# Altium project FPGA_Modular_DevBoard.PrjPcb (part 1 of 2)
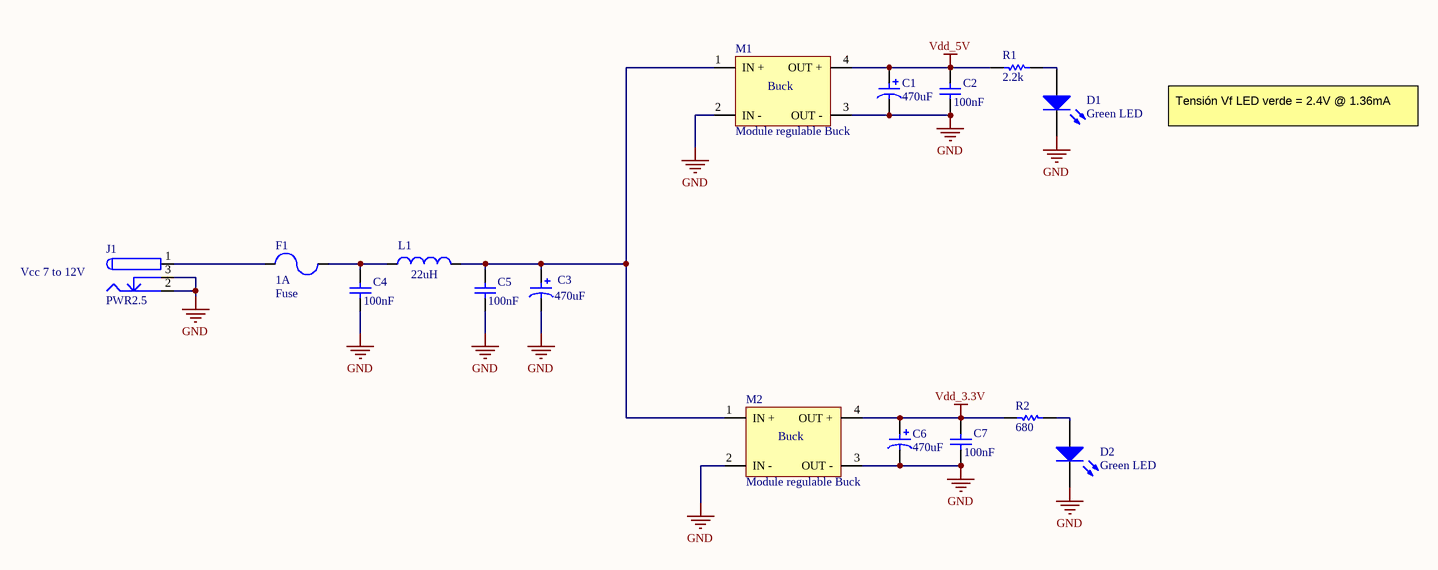
[diagram p0: power_supply.SchDoc]
15 sheets, 292 parts. Net scope: global (net labels, ports and power ports of the same name join across sheets).
Board file: PCB.PcbDoc
Sheets:
  power_supply.SchDoc
  FPGA_J3_J4.SchDoc
  FPGA_J6_J8.SchDoc
  FPGA_breadboard_connections.SchDoc
  stm32h750.SchDoc
  stm32f411.SchDoc
  SRAM.SchDoc
  Parallel_NOR_FLASH.SchDoc
  NOR_flash.SchDoc
  USB_TTL_converter.SchDoc
  buzzer.SchDoc
  micro_sd.SchDoc
  LEDs.SchDoc
  buttons_switches.SchDoc
  seven_segment_displays.SchDoc

## Sheet power_supply.SchDoc
size A3; SheetNumber: 1; SheetTotal: 16; SPICEModelCacheCEUNFSJS: <root> / <DocumentId>CEUNFSJS</DocumentId> / </root>

### Parts
C1  value 470uF  [electrolytic 470uF/25V]  (hidden comment: Electrolytic capacitor)
C2  value 100nF  [capacitor 0805]  (hidden comment: ceramic capacitor)
C3  value 470uF  [electrolytic 470uF/25V]  (hidden comment: Electrolytic capacitor)
C4  value 100nF  [capacitor 0805]  (hidden comment: ceramic capacitor)
C5  value 100nF  [capacitor 0805]  (hidden comment: ceramic capacitor)
C6  value 470uF  [electrolytic 470uF/25V]  (hidden comment: Electrolytic capacitor)
C7  value 100nF  [capacitor 0805]  (hidden comment: ceramic capacitor)
D1  Green LED  [led 0603 clear]
D2  Green LED  [led 0603 clear]
F1  Fuse  value 1A  [Fuse]
J1  PWR2.5  [female connector DC-005]
L1  value 22uH  [ferrite inductor 22uH]  (hidden comment: Inductor)
M1  Module regulable Buck  [module step down MP1584]
M2  Module regulable Buck  [module step down MP1584]
R1  value 2.2k  [resistor 0603]  (hidden comment: resistor)
R2  value 680  [resistor 0603]  (hidden comment: resistor)

### Nets
GND: C1.2 C2.2 C3.2 C4.2 C5.2 C6.2 C7.2 D1.2(K) D2.2(K) J1.2 J1.3 M1.2(IN_-) M1.3(OUT_-) M2.2(IN_-) M2.3(OUT_-)
Vdd_3.3V: C6.1 C7.1 M2.4(OUT_+) R2.2
Vdd_5V: C1.1 C2.1 M1.4(OUT_+) R1.2
NetC3_1: C3.1 C5.1 L1.2 M1.1(IN_+) M2.1(IN_+)
NetC4_1: C4.1 F1.2 L1.1
NetD1_1: D1.1(A) R1.1
NetD2_1: D2.1(A) R2.1
NetF1_1: F1.1 J1.1

### Notes on the sheet
- Tensión Vf LED verde = 2.4V @ 1.36mA
- Vcc 7 to 12V
- (in symbol Module regulable Step Down converter) Buck

### Library data of the parts
C2 C4 C5 C7 = ceramic capacitor: Multilayer ceramic capacitor; V: 50; LCSC part: C1711; Package: 0805
D1 D2 = LED2: Green LED 0603; Package: 0603
J1 = PWR2.5: Low Voltage Power Supply Connector; Publisher: Altium Limited
M1 M2 = Module regulable Step Down converter: pin to pad: 1>2 2>1 3>4 4>3
R1 R2 = resistor: Package: 0603

## Sheet FPGA_J3_J4.SchDoc
size A3; SheetNumber: 2; SheetTotal: 14
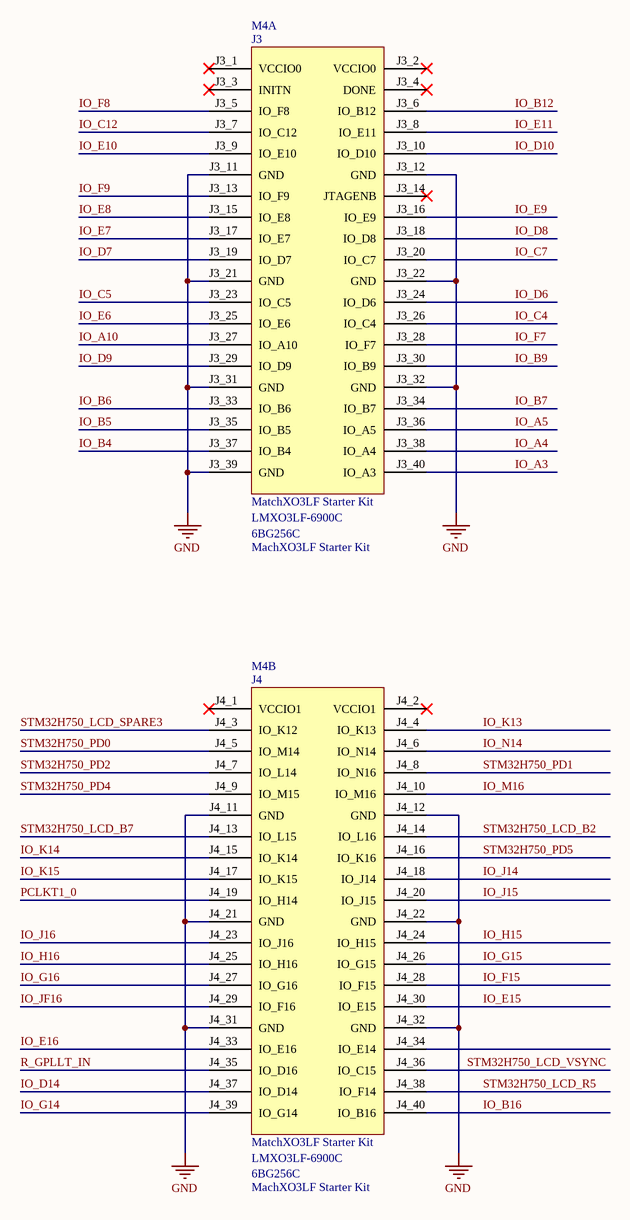
[diagram p1: FPGA_J3_J4.SchDoc]

### Parts
M4  MachXO3LF Starter Kit  [Lattice MachXO3LF starter kit]  (parts A,B of 4)

### Nets
GND: M4.J3_11(GND) M4.J3_12(GND) M4.J3_21(GND) M4.J3_22(GND) M4.J3_31(GND) M4.J3_32(GND) M4.J3_39(GND) M4.J4_11(GND) M4.J4_12(GND) M4.J4_21(GND) M4.J4_22(GND) M4.J4_31(GND) M4.J4_32(GND)
IO_A3: M4.J3_40(IO_A3)
IO_A4: M4.J3_38(IO_A4)
IO_A5: M4.J3_36(IO_A5)
IO_A10: M4.J3_27(IO_A10)
IO_B4: M4.J3_37(IO_B4)
IO_B5: M4.J3_35(IO_B5)
IO_B6: M4.J3_33(IO_B6)
IO_B7: M4.J3_34(IO_B7)
IO_B9: M4.J3_30(IO_B9)
IO_B12: M4.J3_6(IO_B12)
IO_B16: M4.J4_40(IO_B16)
IO_C4: M4.J3_26(IO_C4)
IO_C5: M4.J3_23(IO_C5)
IO_C7: M4.J3_20(IO_C7)
IO_C12: M4.J3_7(IO_C12)
IO_D6: M4.J3_24(IO_D6)
IO_D7: M4.J3_19(IO_D7)
IO_D8: M4.J3_18(IO_D8)
IO_D9: M4.J3_29(IO_D9)
IO_D10: M4.J3_10(IO_D10)
IO_D14: M4.J4_37(IO_D14)
IO_E6: M4.J3_25(IO_E6)
IO_E7: M4.J3_17(IO_E7)
IO_E8: M4.J3_15(IO_E8)
IO_E9: M4.J3_16(IO_E9)
IO_E10: M4.J3_9(IO_E10)
IO_E11: M4.J3_8(IO_E11)
IO_E15: M4.J4_30(IO_E15)
IO_E16: M4.J4_33(IO_E16)
IO_F7: M4.J3_28(IO_F7)
IO_F8: M4.J3_5(IO_F8)
IO_F9: M4.J3_13(IO_F9)
IO_F15: M4.J4_28(IO_F15)
IO_G14: M4.J4_39(IO_G14)
IO_G15: M4.J4_26(IO_G15)
IO_G16: M4.J4_27(IO_G16)
IO_H15: M4.J4_24(IO_H15)
IO_H16: M4.J4_25(IO_H16)
IO_J14: M4.J4_18(IO_J14)
IO_J15: M4.J4_20(IO_J15)
IO_J16: M4.J4_23(IO_J16)
IO_JF16: M4.J4_29(IO_F16)
IO_K13: M4.J4_4(IO_K13)
IO_K14: M4.J4_15(IO_K14)
IO_K15: M4.J4_17(IO_K15)
IO_M16: M4.J4_10(IO_M16)
IO_N14: M4.J4_6(IO_N14)
PCLKT1_0: M4.J4_19(IO_H14)
R_GPLLT_IN: M4.J4_35(IO_D16)
STM32H750_LCD_B2: M4.J4_14(IO_L16)
STM32H750_LCD_B7: M4.J4_13(IO_L15)
STM32H750_LCD_R5: M4.J4_38(IO_F14)
STM32H750_LCD_SPARE3: M4.J4_3(IO_K12)
STM32H750_LCD_VSYNC: M4.J4_36(IO_C15)
STM32H750_PD0: M4.J4_5(IO_M14)
STM32H750_PD1: M4.J4_8(IO_N16)
STM32H750_PD2: M4.J4_7(IO_L14)
STM32H750_PD4: M4.J4_9(IO_M15)
STM32H750_PD5: M4.J4_16(IO_K16)

Not connected (* = marked no-connect by the designer): M4 J3_1(VCCIO0)* J3_2(VCCIO0)* J3_3(INITN)* J3_4(DONE)* J3_14(JTAGENB)* J4_1(VCCIO1)* J4_2(VCCIO1)* J4_34(IO_E14)

### Notes on the sheet
- (in symbol Lattice_MachXO3LF_starter_kit, part A) J3; MatchXO3LF Starter Kit; LMXO3LF-6900C; 6BG256C
- (in symbol Lattice_MachXO3LF_starter_kit, part B) J4; MatchXO3LF Starter Kit; LMXO3LF-6900C; 6BG256C

### Library data of the parts
M4 = Lattice_MachXO3LF_starter_kit: FPGA development board - MachXO3LF Starter Kit

## Sheet FPGA_J6_J8.SchDoc
size A3; SheetNumber: 3; SheetTotal: 14
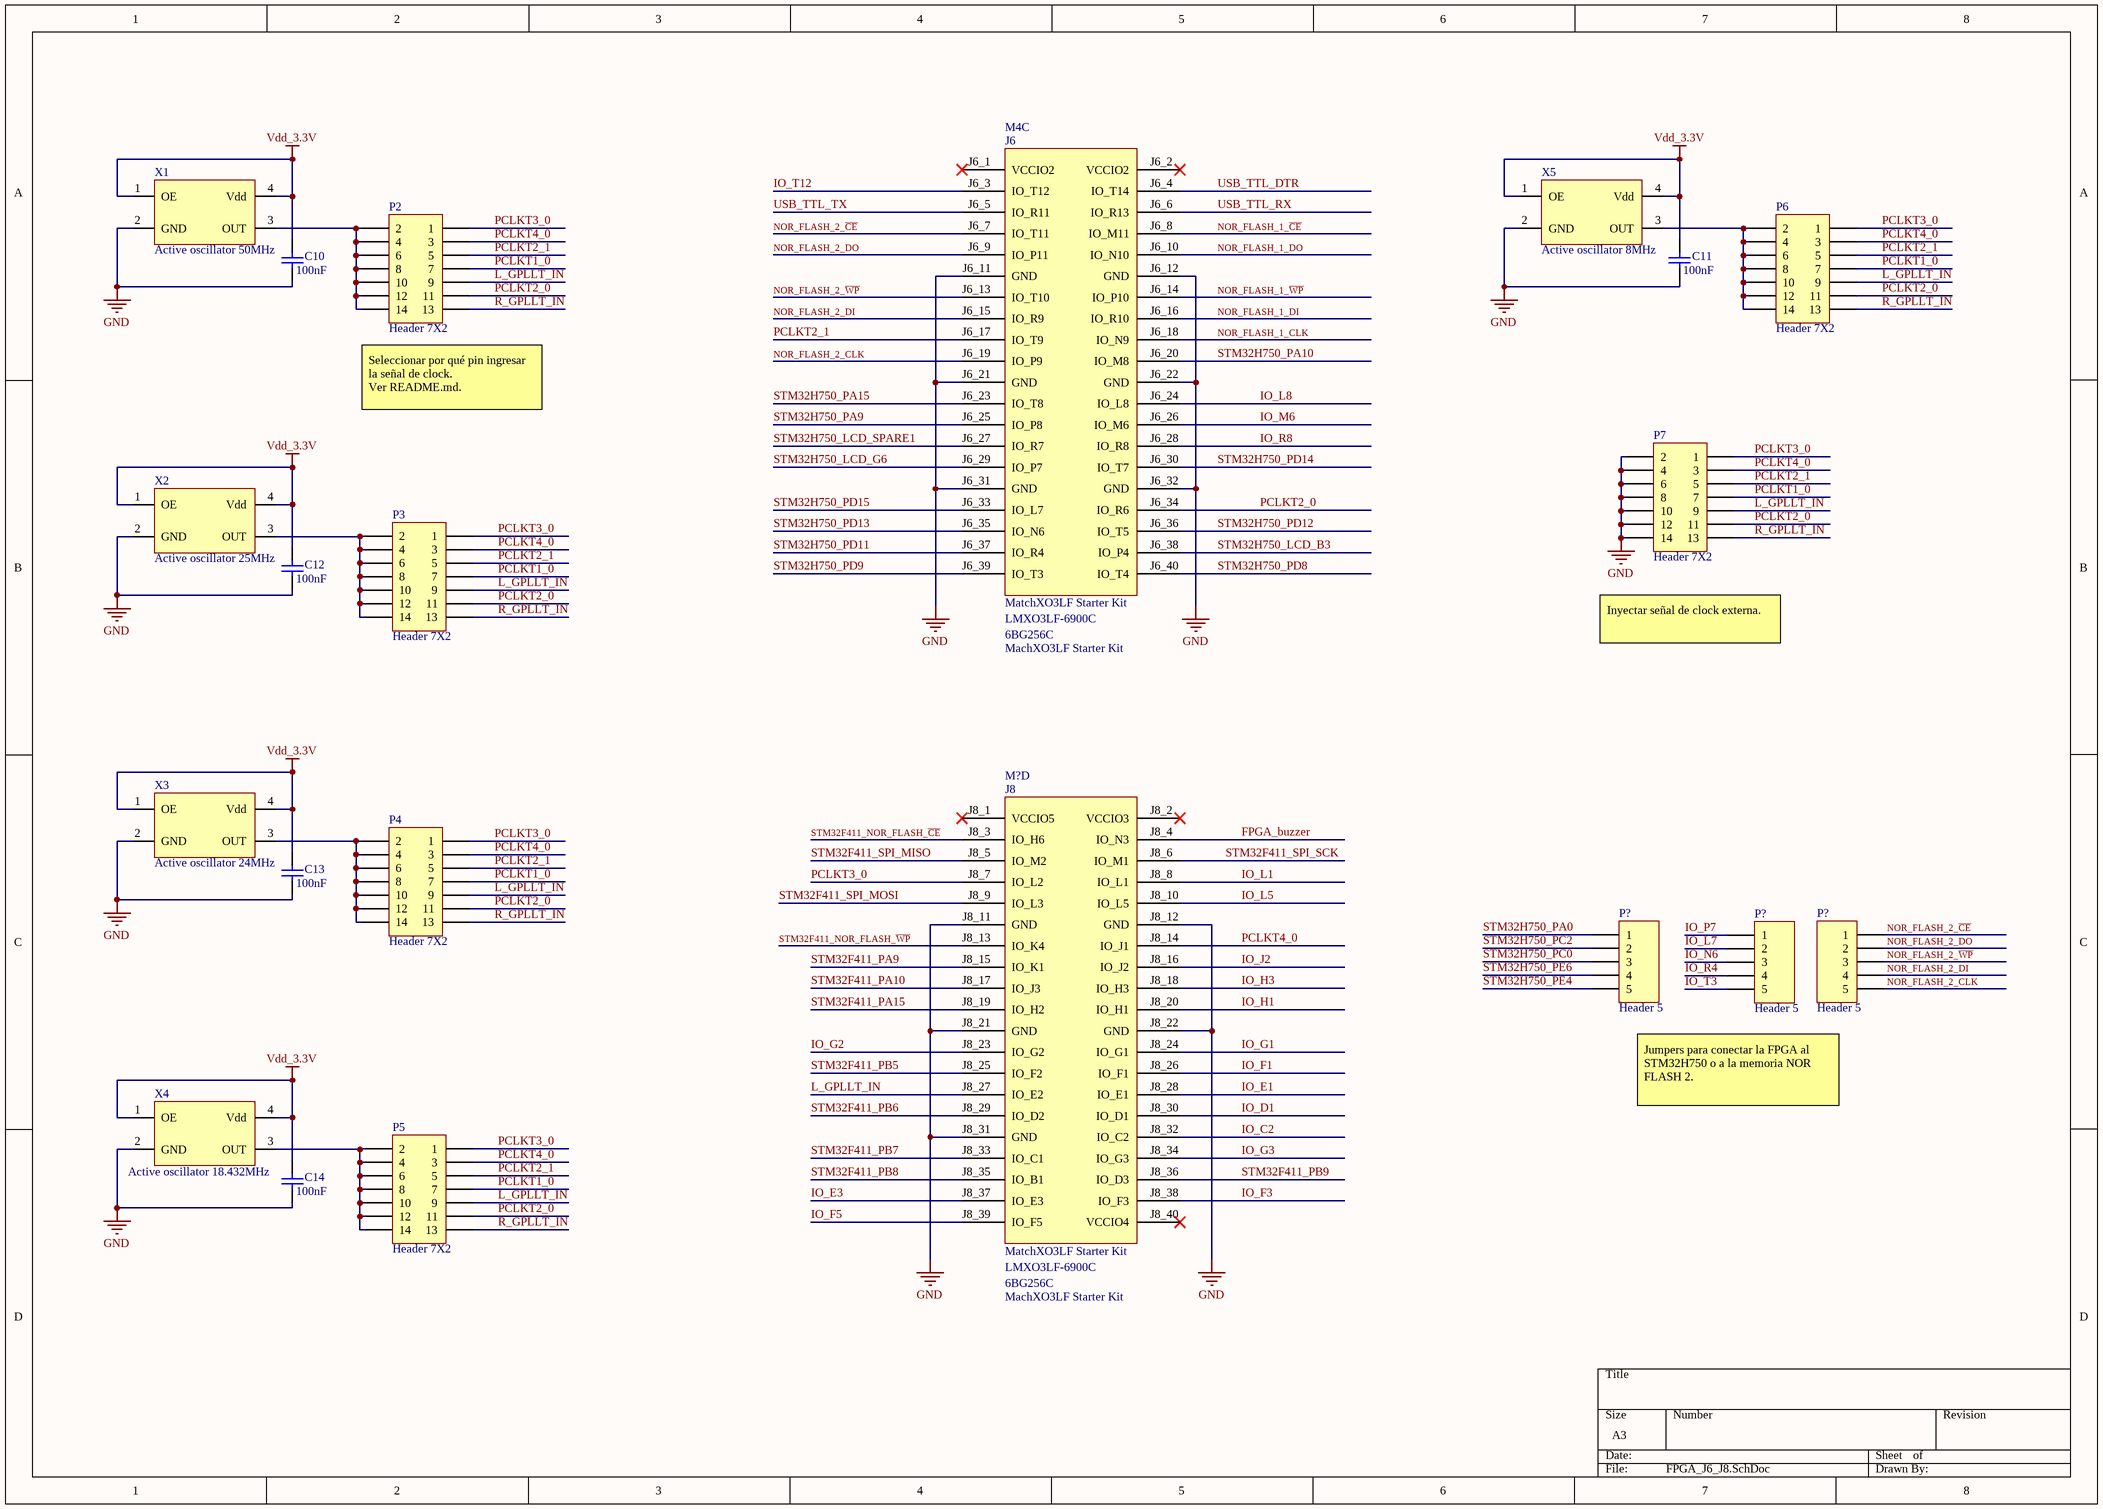
[diagram p2: FPGA_J6_J8.SchDoc]

### Parts
(Parts that share a designator on the sheet are numbered #1, #2 ... from top to bottom, then left to right.)
C10  value 100nF  [capacitor 0603]  (hidden comment: Ceramic capacitor)
C11  value 100nF  [capacitor 0603]  (hidden comment: Ceramic capacitor)
C12  value 100nF  [capacitor 0603]  (hidden comment: Ceramic capacitor)
C13  value 100nF  [capacitor 0603]  (hidden comment: Ceramic capacitor)
C14  value 100nF  [capacitor 0603]  (hidden comment: Ceramic capacitor)
M4  MachXO3LF Starter Kit  [Lattice MachXO3LF starter kit]  (part C of 4)
M?  MachXO3LF Starter Kit  [Lattice MachXO3LF starter kit]  (part D of 4)
P2  Header 7X2  [HDR2X7]
P3  Header 7X2  [HDR2X7]
P4  Header 7X2  [HDR2X7]
P5  Header 7X2  [HDR2X7]
P6  Header 7X2  [HDR2X7]
P7  Header 7X2  [HDR2X7]
P?#1  Header 5  [HDR1X5]
P?#2  Header 5  [HDR1X5]
P?#3  Header 5  [HDR1X5]
X1  Active oscillator 50MHz  [Active oscillator 3.2mm x 2.5mm]
X2  Active oscillator 25MHz  [Active oscillator 3.2mm x 2.5mm]
X3  Active oscillator 24MHz  [Active oscillator 3.2mm x 2.5mm]
X4  Active oscillator 18.432MHz  [Active oscillator 3.2mm x 2.5mm]
X5  Active oscillator 8MHz  [Active oscillator 3.2mm x 2.5mm]

### Nets
GND: C10.1 C11.1 C12.1 C13.1 C14.1 M4.J6_11(GND) M4.J6_12(GND) M4.J6_21(GND) M4.J6_22(GND) M4.J6_31(GND) M4.J6_32(GND) M?.J8_11(GND) M?.J8_12(GND) M?.J8_21(GND) M?.J8_22(GND) M?.J8_31(GND) P7.2 P7.4 P7.6 P7.8 P7.10 P7.12 P7.14 X1.2(GND) X2.2(GND) X3.2(GND) X4.2(GND) X5.2(GND)
Vdd_3.3V: C10.2 C11.2 C12.2 C13.2 C14.2 X1.1(OE) X1.4(Vdd) X2.1(OE) X2.4(Vdd) X3.1(OE) X3.4(Vdd) X4.1(OE) X4.4(Vdd) X5.1(OE) X5.4(Vdd)
FPGA_buzzer: M?.J8_4(IO_N3)
IO_C2: M?.J8_32(IO_C2)
IO_D1: M?.J8_30(IO_D1)
IO_E1: M?.J8_28(IO_E1)
IO_E3: M?.J8_37(IO_E3)
IO_F1: M?.J8_26(IO_F1)
IO_F3: M?.J8_38(IO_F3)
IO_F5: M?.J8_39(IO_F5)
IO_G1: M?.J8_24(IO_G1)
IO_G2: M?.J8_23(IO_G2)
IO_G3: M?.J8_34(IO_G3)
IO_H1: M?.J8_20(IO_H1)
IO_H3: M?.J8_18(IO_H3)
IO_J2: M?.J8_16(IO_J2)
IO_L1: M?.J8_8(IO_L1)
IO_L5: M?.J8_10(IO_L5)
IO_L7: P?#2.2
IO_L8: M4.J6_24(IO_L8)
IO_M6: M4.J6_26(IO_M6)
IO_N6: P?#2.3
IO_P7: P?#2.1
IO_R4: P?#2.4
IO_R8: M4.J6_28(IO_R8)
IO_T3: P?#2.5
IO_T12: M4.J6_3(IO_T12)
L_GPLLT_IN: M?.J8_27(IO_E2) P2.9 P3.9 P4.9 P5.9 P6.9 P7.9
NOR_FLASH_1_~{CE}: M4.J6_8(IO_M11)
NOR_FLASH_1_CLK: M4.J6_18(IO_N9)
NOR_FLASH_1_DI: M4.J6_16(IO_R10)
NOR_FLASH_1_DO: M4.J6_10(IO_N10)
NOR_FLASH_1_~{WP}: M4.J6_14(IO_P10)
NOR_FLASH_2_~{CE}: M4.J6_7(IO_T11) P?#3.1
NOR_FLASH_2_CLK: M4.J6_19(IO_P9) P?#3.5
NOR_FLASH_2_DI: M4.J6_15(IO_R9) P?#3.4
NOR_FLASH_2_DO: M4.J6_9(IO_P11) P?#3.2
NOR_FLASH_2_~{WP}: M4.J6_13(IO_T10) P?#3.3
PCLKT1_0: P2.7 P3.7 P4.7 P5.7 P6.7 P7.7
PCLKT2_0: M4.J6_34(IO_R6) P2.11 P3.11 P4.11 P5.11 P6.11 P7.11
PCLKT2_1: M4.J6_17(IO_T9) P2.5 P3.5 P4.5 P5.5 P6.5 P7.5
PCLKT3_0: M?.J8_7(IO_L2) P2.1 P3.1 P4.1 P5.1 P6.1 P7.1
PCLKT4_0: M?.J8_14(IO_J1) P2.3 P3.3 P4.3 P5.3 P6.3 P7.3
R_GPLLT_IN: P2.13 P3.13 P4.13 P5.13 P6.13 P7.13
STM32F411_NOR_FLASH_~{CE}: M?.J8_3(IO_H6)
STM32F411_NOR_FLASH_~{WP}: M?.J8_13(IO_K4)
STM32F411_PA9: M?.J8_15(IO_K1)
STM32F411_PA10: M?.J8_17(IO_J3)
STM32F411_PA15: M?.J8_19(IO_H2)
STM32F411_PB5: M?.J8_25(IO_F2)
STM32F411_PB6: M?.J8_29(IO_D2)
STM32F411_PB7: M?.J8_33(IO_C1)
STM32F411_PB8: M?.J8_35(IO_B1)
STM32F411_PB9: M?.J8_36(IO_D3)
STM32F411_SPI_MISO: M?.J8_5(IO_M2)
STM32F411_SPI_MOSI: M?.J8_9(IO_L3)
STM32F411_SPI_SCK: M?.J8_6(IO_M1)
STM32H750_LCD_B3: M4.J6_38(IO_P4)
STM32H750_LCD_G6: M4.J6_29(IO_P7)
STM32H750_LCD_SPARE1: M4.J6_27(IO_R7)
STM32H750_PA0: P?#1.1
STM32H750_PA9: M4.J6_25(IO_P8)
STM32H750_PA10: M4.J6_20(IO_M8)
STM32H750_PA15: M4.J6_23(IO_T8)
STM32H750_PC0: P?#1.3
STM32H750_PC2: P?#1.2
STM32H750_PD8: M4.J6_40(IO_T4)
STM32H750_PD9: M4.J6_39(IO_T3)
STM32H750_PD11: M4.J6_37(IO_R4)
STM32H750_PD12: M4.J6_36(IO_T5)
STM32H750_PD13: M4.J6_35(IO_N6)
STM32H750_PD14: M4.J6_30(IO_T7)
STM32H750_PD15: M4.J6_33(IO_L7)
STM32H750_PE4: P?#1.5
STM32H750_PE6: P?#1.4
USB_TTL_DTR: M4.J6_4(IO_T14)
USB_TTL_RX: M4.J6_6(IO_R13)
USB_TTL_TX: M4.J6_5(IO_R11)
NetP2_2: P2.2 P2.4 P2.6 P2.8 P2.10 P2.12 P2.14 X1.3(OUT)
NetP3_2: P3.2 P3.4 P3.6 P3.8 P3.10 P3.12 P3.14 X2.3(OUT)
NetP4_2: P4.2 P4.4 P4.6 P4.8 P4.10 P4.12 P4.14 X3.3(OUT)
NetP5_2: P5.2 P5.4 P5.6 P5.8 P5.10 P5.12 P5.14 X4.3(OUT)
NetP6_2: P6.2 P6.4 P6.6 P6.8 P6.10 P6.12 P6.14 X5.3(OUT)

Not connected (* = marked no-connect by the designer): M4 J6_1(VCCIO2)* J6_2(VCCIO2)*; M? J8_1(VCCIO5)* J8_2(VCCIO3)* J8_40(VCCIO4)*

### Notes on the sheet
- (near P2) Seleccionar por qué pin ingresar la señal de clock.
  Ver README.md.
- Inyectar señal de clock externa.
- (near P?#2) Jumpers para conectar la FPGA al STM32H750 o a la memoria NOR FLASH 2.
- (in symbol Lattice_MachXO3LF_starter_kit, part C) J6; MatchXO3LF Starter Kit; LMXO3LF-6900C; 6BG256C
- (in symbol Lattice_MachXO3LF_starter_kit, part D) J8; MatchXO3LF Starter Kit; LMXO3LF-6900C; 6BG256C

### Library data of the parts
C10-C14 = Ceramic capacitor: Multilayer ceramic capacitor; V: 50; LCSC part: C14663; Package: 0603
M4 M? = Lattice_MachXO3LF_starter_kit: as M4 on sheet FPGA_J3_J4
P2-P7 = Header 7X2: Header, 7-Pin, Dual row; LatestRevisionDate: 17-Jul-2002; LatestRevisionNote: Re-released for DXP Platform.; Publisher: Altium Limited
P?#1-P?#3 = Header 5: Header, 5-Pin; LatestRevisionDate: 17-Jul-2002; LatestRevisionNote: Re-released for DXP Platform.; Publisher: Altium Limited
X1-X5 = Active oscillator

## Sheet FPGA_breadboard_connections.SchDoc
size A3; SheetNumber: 4; SheetTotal: 15
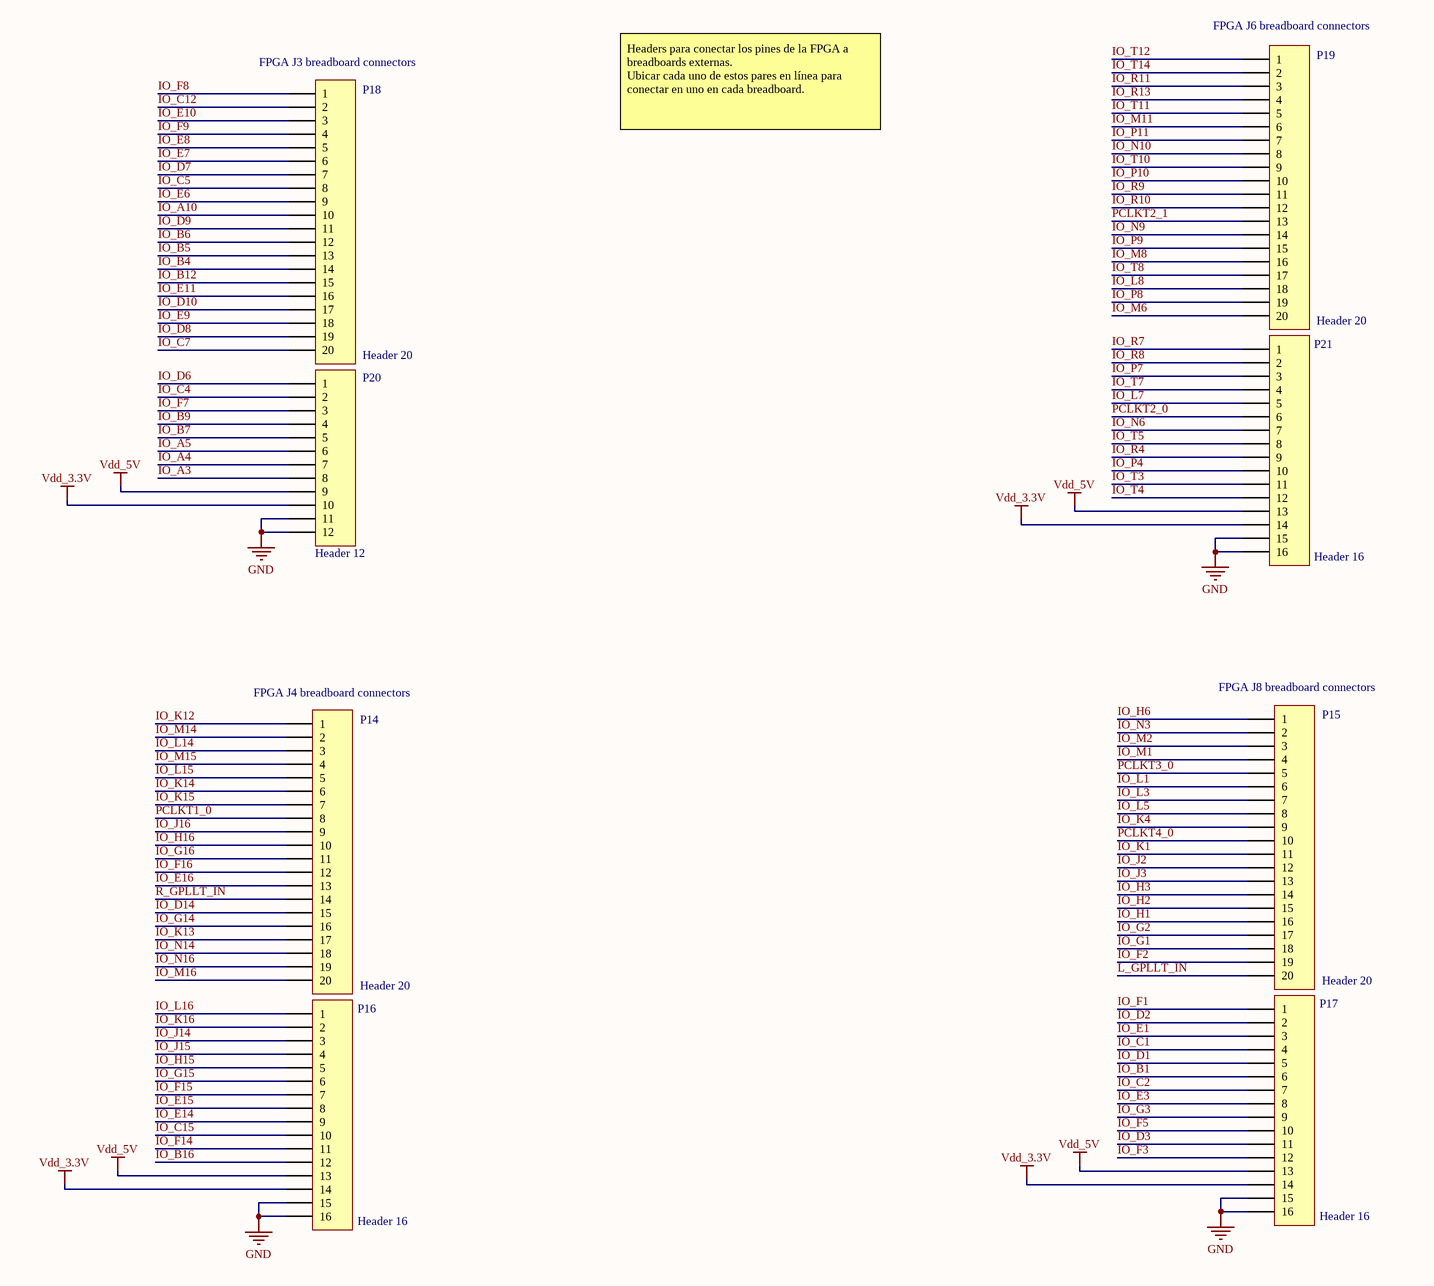
[diagram p3: FPGA_breadboard_connections.SchDoc]

### Parts
P14  Header 20  [HDR1X20]
P15  Header 20  [HDR1X20]
P16  Header 16  [HDR1X16]
P17  Header 16  [HDR1X16]
P18  Header 20  [HDR1X20]
P19  Header 20  [HDR1X20]
P20  Header 12  [HDR1X12]
P21  Header 16  [HDR1X16]

### Nets
GND: P16.15 P16.16 P17.15 P17.16 P20.11 P20.12 P21.15 P21.16
Vdd_3.3V: P16.14 P17.14 P20.10 P21.14
Vdd_5V: P16.13 P17.13 P20.9 P21.13
IO_A3: P20.8
IO_A4: P20.7
IO_A5: P20.6
IO_A10: P18.10
IO_B1: P17.6
IO_B4: P18.14
IO_B5: P18.13
IO_B6: P18.12
IO_B7: P20.5
IO_B9: P20.4
IO_B12: P18.15
IO_B16: P16.12
IO_C1: P17.4
IO_C2: P17.7
IO_C4: P20.2
IO_C5: P18.8
IO_C7: P18.20
IO_C12: P18.2
IO_C15: P16.10
IO_D1: P17.5
IO_D2: P17.2
IO_D3: P17.11
IO_D6: P20.1
IO_D7: P18.7
IO_D8: P18.19
IO_D9: P18.11
IO_D10: P18.17
IO_D14: P14.15
IO_E1: P17.3
IO_E3: P17.8
IO_E6: P18.9
IO_E7: P18.6
IO_E8: P18.5
IO_E9: P18.18
IO_E10: P18.3
IO_E11: P18.16
IO_E14: P16.9
IO_E15: P16.8
IO_E16: P14.13
IO_F1: P17.1
IO_F2: P15.19
IO_F3: P17.12
IO_F5: P17.10
IO_F7: P20.3
IO_F8: P18.1
IO_F9: P18.4
IO_F14: P16.11
IO_F15: P16.7
IO_F16: P14.12
IO_G1: P15.18
IO_G2: P15.17
IO_G3: P17.9
IO_G14: P14.16
IO_G15: P16.6
IO_G16: P14.11
IO_H1: P15.16
IO_H2: P15.15
IO_H3: P15.14
IO_H6: P15.1
IO_H15: P16.5
IO_H16: P14.10
IO_J2: P15.12
IO_J3: P15.13
IO_J14: P16.3
IO_J15: P16.4
IO_J16: P14.9
IO_K1: P15.11
IO_K4: P15.9
IO_K12: P14.1
IO_K13: P14.17
IO_K14: P14.6
IO_K15: P14.7
IO_K16: P16.2
IO_L1: P15.6
IO_L3: P15.7
IO_L5: P15.8
IO_L7: P21.5
IO_L8: P19.18
IO_L14: P14.3
IO_L15: P14.5
IO_L16: P16.1
IO_M1: P15.4
IO_M2: P15.3
IO_M6: P19.20
IO_M8: P19.16
IO_M11: P19.6
IO_M14: P14.2
IO_M15: P14.4
IO_M16: P14.20
IO_N3: P15.2
IO_N6: P21.7
IO_N9: P19.14
IO_N10: P19.8
IO_N14: P14.18
IO_N16: P14.19
IO_P4: P21.10
IO_P7: P21.3
IO_P8: P19.19
IO_P9: P19.15
IO_P10: P19.10
IO_P11: P19.7
IO_R4: P21.9
IO_R7: P21.1
IO_R8: P21.2
IO_R9: P19.11
IO_R10: P19.12
IO_R11: P19.3
IO_R13: P19.4
IO_T3: P21.11
IO_T4: P21.12
IO_T5: P21.8
IO_T7: P21.4
IO_T8: P19.17
IO_T10: P19.9
IO_T11: P19.5
IO_T12: P19.1
IO_T14: P19.2
L_GPLLT_IN: P15.20
PCLKT1_0: P14.8
PCLKT2_0: P21.6
PCLKT2_1: P19.13
PCLKT3_0: P15.5
PCLKT4_0: P15.10
R_GPLLT_IN: P14.14

### Notes on the sheet
- (near P19) FPGA J6 breadboard connectors
- (near P18) FPGA J3 breadboard connectors
- Headers para conectar los pines de la FPGA a breadboards externas.
  Ubicar cada uno de estos pares en línea para conectar en uno en cada breadboard.
- (near P14) FPGA J4 breadboard connectors
- (near P15) FPGA J8 breadboard connectors

### Library data of the parts
P14 P15 P18 P19 = Header 20: Header, 20-Pin; LatestRevisionDate: 17-Jul-2002; LatestRevisionNote: Re-released for DXP Platform.; Publisher: Altium Limited
P16 P17 P21 = Header 16: Header, 16-Pin; LatestRevisionDate: 17-Jul-2002; LatestRevisionNote: Re-released for DXP Platform.; Publisher: Altium Limited
P20 = Header 12: Header, 12-Pin; LatestRevisionDate: 17-Jul-2002; LatestRevisionNote: Re-released for DXP Platform.; Publisher: Altium Limited

## Sheet stm32h750.SchDoc
size A3; SheetNumber: 5; SheetTotal: 17
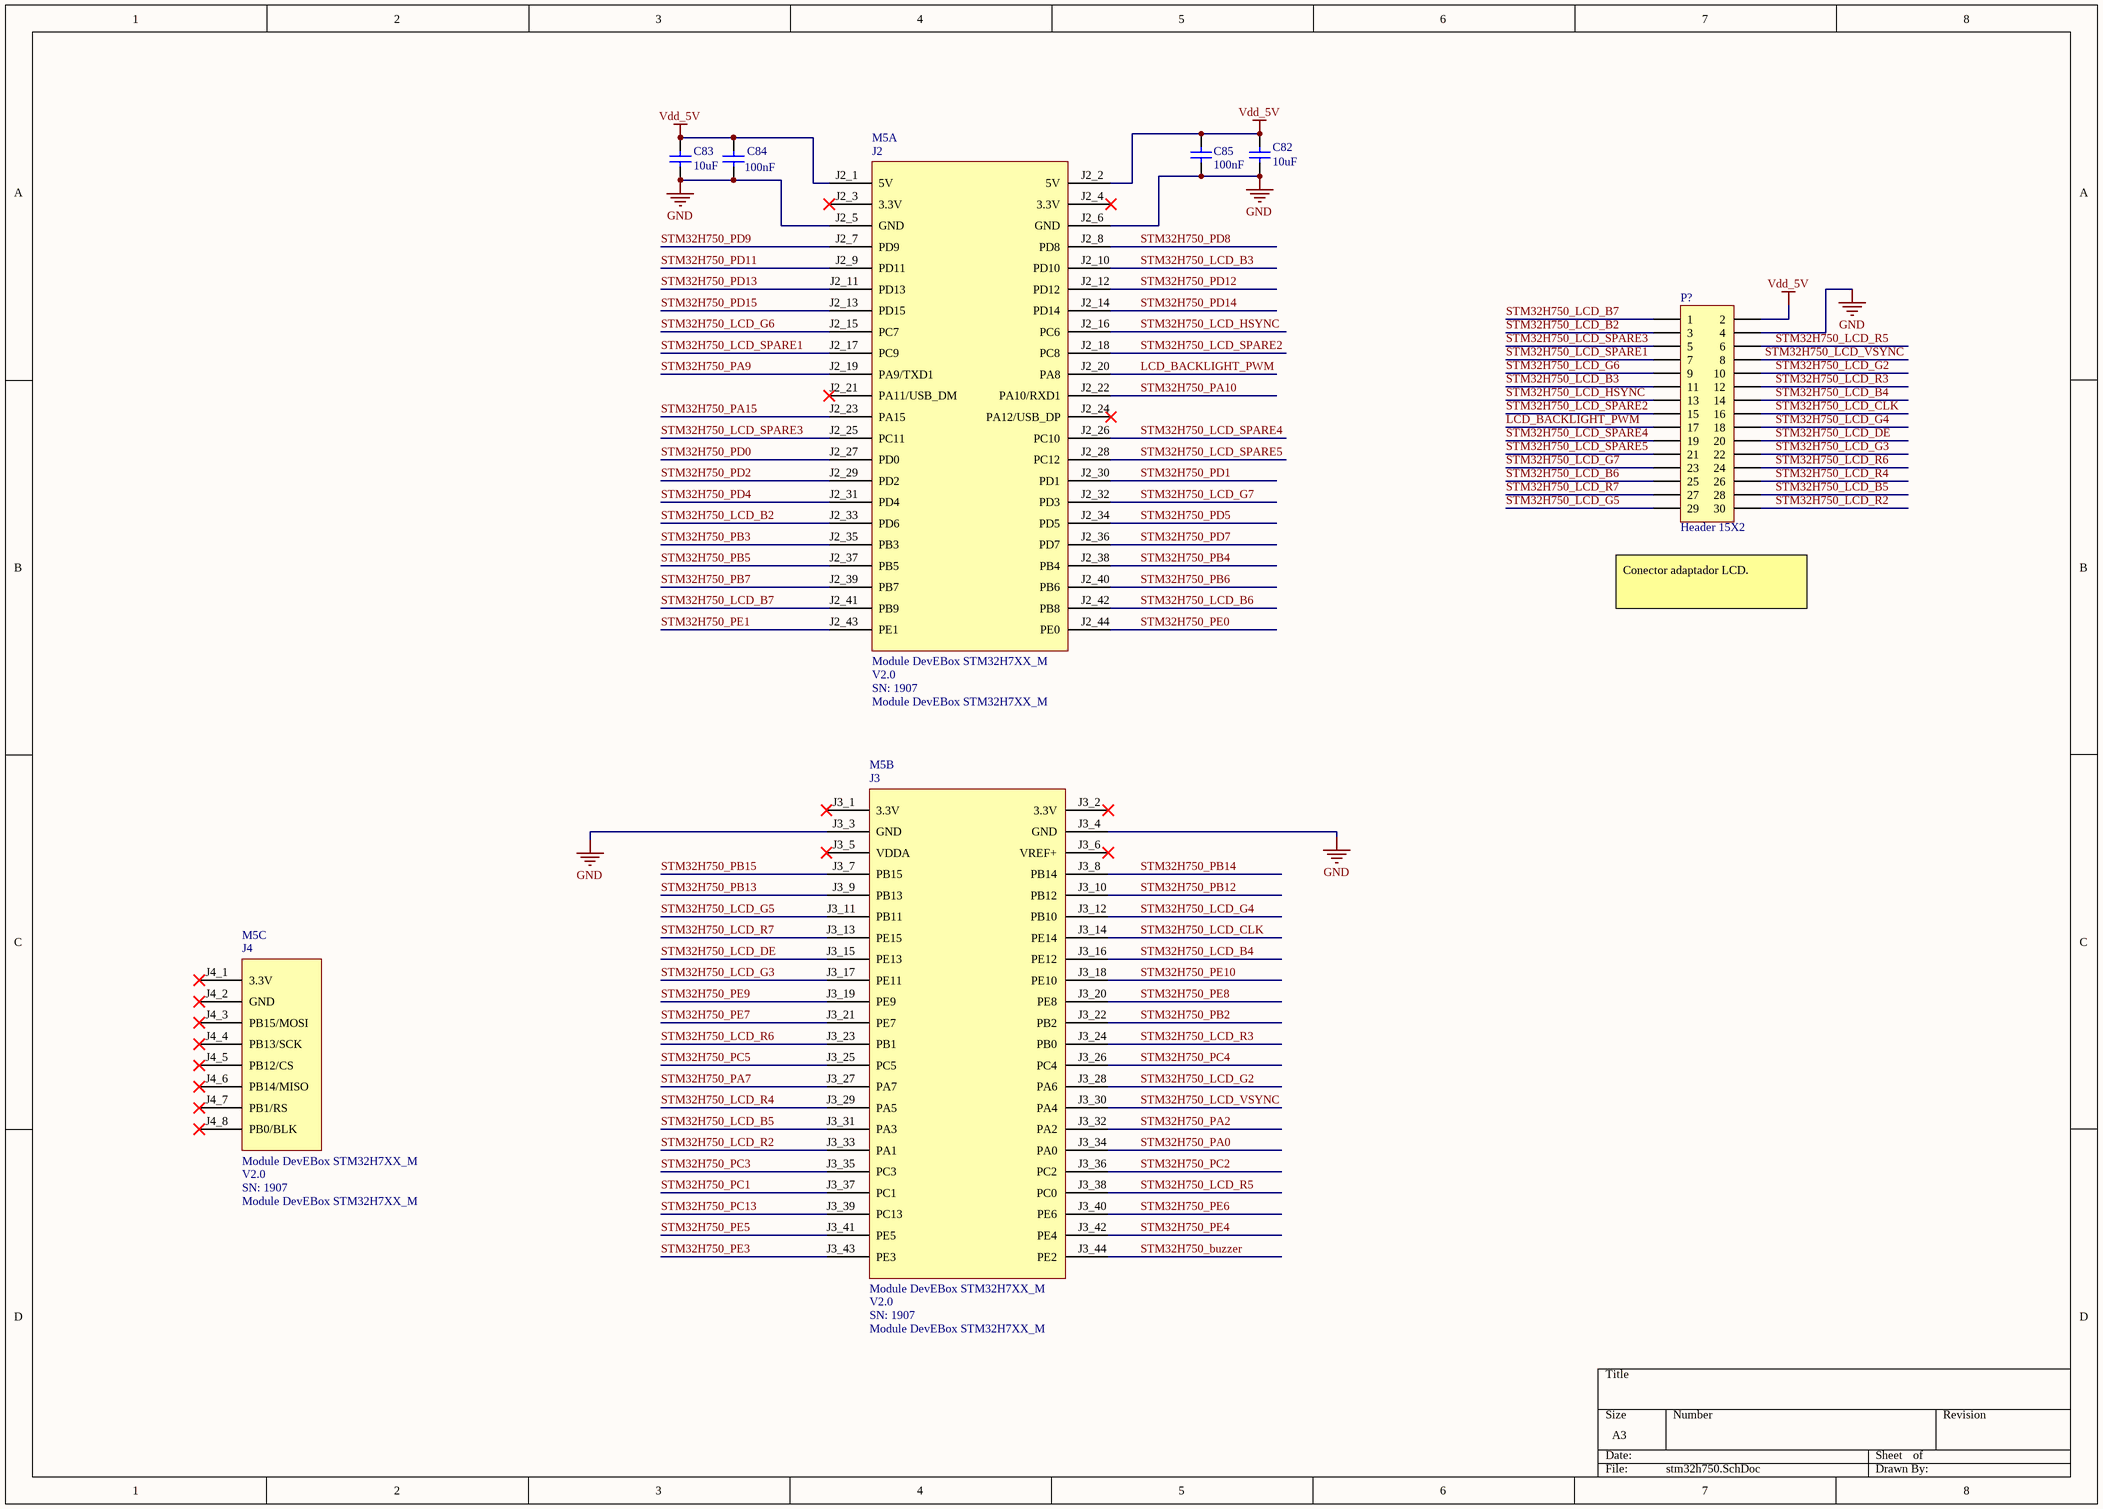
[diagram p4: stm32h750.SchDoc]

### Parts
(Parts that share a designator on the sheet are numbered #1, #2 ... from top to bottom, then left to right.)
C82  value 10uF  [capacitor 0603]  (hidden comment: ceramic capacitor)
C83  value 10uF  [capacitor 0603]  (hidden comment: ceramic capacitor)
C84  value 100nF  [capacitor 0603]  (hidden comment: Ceramic capacitor)
C85  value 100nF  [capacitor 0603]  (hidden comment: Ceramic capacitor)
M5  Module DevEBox STM32H7XX_M  [Module DevEBox STM32H7XX_M]  (parts A,B,C of 3)
P?#4  Header 15X2  [HDR2X15]

### Nets
GND: C82.1 C83.1 C84.1 C85.1 M5.J2_5(GND) M5.J2_6(GND) M5.J3_3(GND) M5.J3_4(GND) P?#4.4
Vdd_5V: C82.2 C83.2 C84.2 C85.2 M5.J2_1(5V) M5.J2_2(5V) P?#4.2
LCD_BACKLIGHT_PWM: M5.J2_20(PA8) P?#4.17
STM32H750_buzzer: M5.J3_44(PE2)
STM32H750_LCD_B2: M5.J2_33(PD6) P?#4.3
STM32H750_LCD_B3: M5.J2_10(PD10) P?#4.11
STM32H750_LCD_B4: M5.J3_16(PE12) P?#4.14
STM32H750_LCD_B5: M5.J3_31(PA3) P?#4.28
STM32H750_LCD_B6: M5.J2_42(PB8) P?#4.25
STM32H750_LCD_B7: M5.J2_41(PB9) P?#4.1
STM32H750_LCD_CLK: M5.J3_14(PE14) P?#4.16
STM32H750_LCD_DE: M5.J3_15(PE13) P?#4.20
STM32H750_LCD_G2: M5.J3_28(PA6) P?#4.10
STM32H750_LCD_G3: M5.J3_17(PE11) P?#4.22
STM32H750_LCD_G4: M5.J3_12(PB10) P?#4.18
STM32H750_LCD_G5: M5.J3_11(PB11) P?#4.29
STM32H750_LCD_G6: M5.J2_15(PC7) P?#4.9
STM32H750_LCD_G7: M5.J2_32(PD3) P?#4.23
STM32H750_LCD_HSYNC: M5.J2_16(PC6) P?#4.13
STM32H750_LCD_R2: M5.J3_33(PA1) P?#4.30
STM32H750_LCD_R3: M5.J3_24(PB0) P?#4.12
STM32H750_LCD_R4: M5.J3_29(PA5) P?#4.26
STM32H750_LCD_R5: M5.J3_38(PC0) P?#4.6
STM32H750_LCD_R6: M5.J3_23(PB1) P?#4.24
STM32H750_LCD_R7: M5.J3_13(PE15) P?#4.27
STM32H750_LCD_SPARE1: M5.J2_17(PC9) P?#4.7
STM32H750_LCD_SPARE2: M5.J2_18(PC8) P?#4.15
STM32H750_LCD_SPARE3: M5.J2_25(PC11) P?#4.5
STM32H750_LCD_SPARE4: M5.J2_26(PC10) P?#4.19
STM32H750_LCD_SPARE5: M5.J2_28(PC12) P?#4.21
STM32H750_LCD_VSYNC: M5.J3_30(PA4) P?#4.8
STM32H750_PA0: M5.J3_34(PA0)
STM32H750_PA2: M5.J3_32(PA2)
STM32H750_PA7: M5.J3_27(PA7)
STM32H750_PA9: M5.J2_19(PA9/TXD1)
STM32H750_PA10: M5.J2_22(PA10/RXD1)
STM32H750_PA15: M5.J2_23(PA15)
STM32H750_PB2: M5.J3_22(PB2)
STM32H750_PB3: M5.J2_35(PB3)
STM32H750_PB4: M5.J2_38(PB4)
STM32H750_PB5: M5.J2_37(PB5)
STM32H750_PB6: M5.J2_40(PB6)
STM32H750_PB7: M5.J2_39(PB7)
STM32H750_PB12: M5.J3_10(PB12)
STM32H750_PB13: M5.J3_9(PB13)
STM32H750_PB14: M5.J3_8(PB14)
STM32H750_PB15: M5.J3_7(PB15)
STM32H750_PC1: M5.J3_37(PC1)
STM32H750_PC2: M5.J3_36(PC2)
STM32H750_PC3: M5.J3_35(PC3)
STM32H750_PC4: M5.J3_26(PC4)
STM32H750_PC5: M5.J3_25(PC5)
STM32H750_PC13: M5.J3_39(PC13)
STM32H750_PD0: M5.J2_27(PD0)
STM32H750_PD1: M5.J2_30(PD1)
STM32H750_PD2: M5.J2_29(PD2)
STM32H750_PD4: M5.J2_31(PD4)
STM32H750_PD5: M5.J2_34(PD5)
STM32H750_PD7: M5.J2_36(PD7)
STM32H750_PD8: M5.J2_8(PD8)
STM32H750_PD9: M5.J2_7(PD9)
STM32H750_PD11: M5.J2_9(PD11)
STM32H750_PD12: M5.J2_12(PD12)
STM32H750_PD13: M5.J2_11(PD13)
STM32H750_PD14: M5.J2_14(PD14)
STM32H750_PD15: M5.J2_13(PD15)
STM32H750_PE0: M5.J2_44(PE0)
STM32H750_PE1: M5.J2_43(PE1)
STM32H750_PE3: M5.J3_43(PE3)
STM32H750_PE4: M5.J3_42(PE4)
STM32H750_PE5: M5.J3_41(PE5)
STM32H750_PE6: M5.J3_40(PE6)
STM32H750_PE7: M5.J3_21(PE7)
STM32H750_PE8: M5.J3_20(PE8)
STM32H750_PE9: M5.J3_19(PE9)
STM32H750_PE10: M5.J3_18(PE10)

Not connected (* = marked no-connect by the designer): M5 J2_3(3.3V)* J2_4(3.3V)* J2_21(PA11/USB_DM)* J2_24(PA12/USB_DP)* J3_1(3.3V)* J3_2(3.3V)* J3_5(VDDA)* J3_6(VREF+)* J4_1(3.3V)* J4_2(GND)* J4_3(PB15/MOSI)* J4_4(PB13/SCK)* J4_5(PB12/CS)* J4_6(PB14/MISO)* J4_7(PB1/RS)* J4_8(PB0/BLK)*

### Notes on the sheet
- (near P?#4) Conector adaptador LCD.
- (in symbol Module DevEBox STM32H7XX_M, part A) J2; V2.0; SN: 1907
- (in symbol Module DevEBox STM32H7XX_M, part B) J3; V2.0; SN: 1907
- (in symbol Module DevEBox STM32H7XX_M, part C) J4; V2.0; SN: 1907

### Library data of the parts
C82 C83 = ceramic capacitor: Multilayer ceramic capacitor; V: 6.3; LCSC part: C1691; Package: 0603
C84 C85 = Ceramic capacitor: Multilayer ceramic capacitor; V: 50; LCSC part: C14663; Package: 0603
M5 = Module DevEBox STM32H7XX_M: Module DevEBox STM32H7XX_M / V2.0 / SN: 1907
P?#4 = Header 15X2: Header, 15-Pin, Dual row; LatestRevisionDate: 17-Jul-2002; LatestRevisionNote: Re-released for DXP Platform.; Publisher: Altium Limited

## Sheet stm32f411.SchDoc
size A3; SheetNumber: 8; SheetTotal: 15
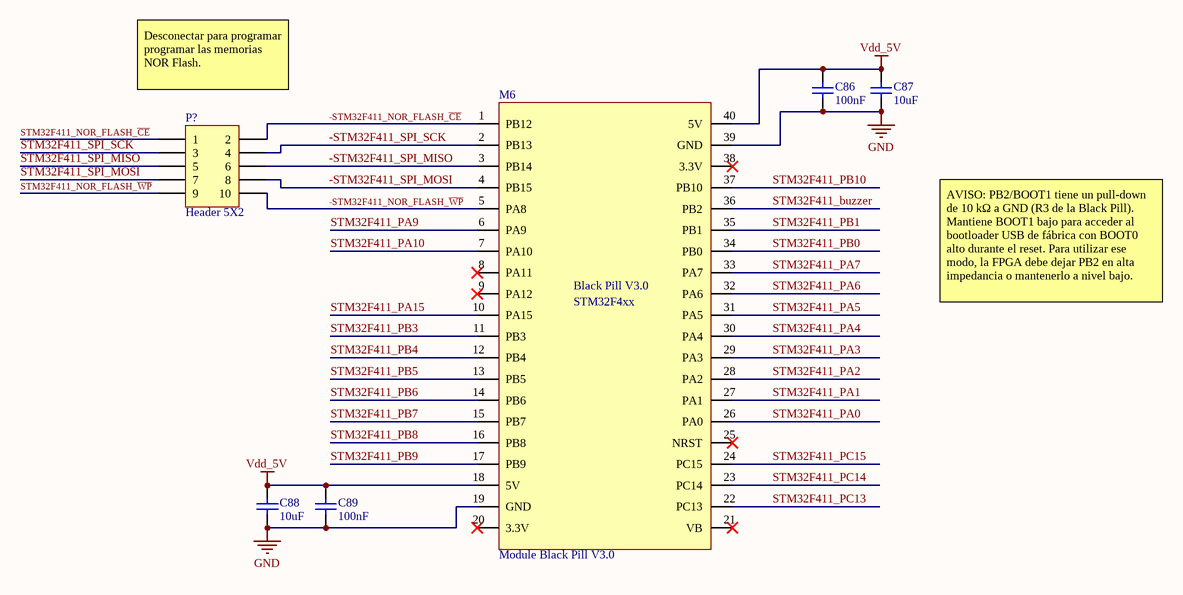
[diagram p5: stm32f411.SchDoc]

### Parts
(Parts that share a designator on the sheet are numbered #1, #2 ... from top to bottom, then left to right.)
C86  value 100nF  [capacitor 0603]  (hidden comment: Ceramic capacitor)
C87  value 10uF  [capacitor 0603]  (hidden comment: ceramic capacitor)
C88  value 10uF  [capacitor 0603]  (hidden comment: ceramic capacitor)
C89  value 100nF  [capacitor 0603]  (hidden comment: Ceramic capacitor)
M6  Module Black Pill V3.0  [module black pill v3.0]
P?#5  Header 5X2  [HDR2X5]

### Nets
GND: C86.1 C87.1 C88.1 C89.1 M6.19(GND) M6.39(GND)
Vdd_5V: C86.2 C87.2 C88.2 C89.2 M6.18(5V) M6.40(5V)
-STM32F411_NOR_FLASH_~{CE}: M6.1(PB12) P?#5.2
-STM32F411_NOR_FLASH_~{WP}: M6.5(PA8) P?#5.10
-STM32F411_SPI_MISO: M6.3(PB14) P?#5.6
-STM32F411_SPI_MOSI: M6.4(PB15) P?#5.8
-STM32F411_SPI_SCK: M6.2(PB13) P?#5.4
STM32F411_buzzer: M6.36(PB2)
STM32F411_NOR_FLASH_~{CE}: P?#5.1
STM32F411_NOR_FLASH_~{WP}: P?#5.9
STM32F411_PA0: M6.26(PA0)
STM32F411_PA1: M6.27(PA1)
STM32F411_PA2: M6.28(PA2)
STM32F411_PA3: M6.29(PA3)
STM32F411_PA4: M6.30(PA4)
STM32F411_PA5: M6.31(PA5)
STM32F411_PA6: M6.32(PA6)
STM32F411_PA7: M6.33(PA7)
STM32F411_PA9: M6.6(PA9)
STM32F411_PA10: M6.7(PA10)
STM32F411_PA15: M6.10(PA15)
STM32F411_PB0: M6.34(PB0)
STM32F411_PB1: M6.35(PB1)
STM32F411_PB3: M6.11(PB3)
STM32F411_PB4: M6.12(PB4)
STM32F411_PB5: M6.13(PB5)
STM32F411_PB6: M6.14(PB6)
STM32F411_PB7: M6.15(PB7)
STM32F411_PB8: M6.16(PB8)
STM32F411_PB9: M6.17(PB9)
STM32F411_PB10: M6.37(PB10)
STM32F411_PC13: M6.22(PC13)
STM32F411_PC14: M6.23(PC14)
STM32F411_PC15: M6.24(PC15)
STM32F411_SPI_MISO: P?#5.5
STM32F411_SPI_MOSI: P?#5.7
STM32F411_SPI_SCK: P?#5.3

Not connected (* = marked no-connect by the designer): M6 8(PA11)* 9(PA12)* 20(3.3V)* 21(VB)* 25(NRST)* 38(3.3V)*

### Notes on the sheet
- (near P?#5) Desconectar para programar programar las memorias NOR Flash.
- AVISO: PB2/BOOT1 tiene un pull-down de 10 kΩ a GND (R3 de la Black Pill). Mantiene BOOT1 bajo para acceder al bootloader USB de fábrica con BOOT0 alto durante el reset. Para utilizar ese modo, la FPGA debe dejar PB2 en alta impedancia o mantenerlo a nivel bajo.
- (in symbol Module Black Pill V3.0) Black Pill V3.0; STM32F4xx

### Library data of the parts
C86 C89 = Ceramic capacitor: Multilayer ceramic capacitor; V: 50; LCSC part: C14663; Package: 0603
C87 C88 = ceramic capacitor: Multilayer ceramic capacitor; V: 6.3; LCSC part: C1691; Package: 0603
M6 = Module Black Pill V3.0: Module Black Pill V3.0 / STM32F4xx
P?#5 = Header 5X2: Header, 5-Pin, Dual row; LatestRevisionDate: 17-Jul-2002; LatestRevisionNote: Re-released for DXP Platform.; Publisher: Altium Limited

## Sheet SRAM.SchDoc
size A3; SheetNumber: 6; SheetTotal: 17
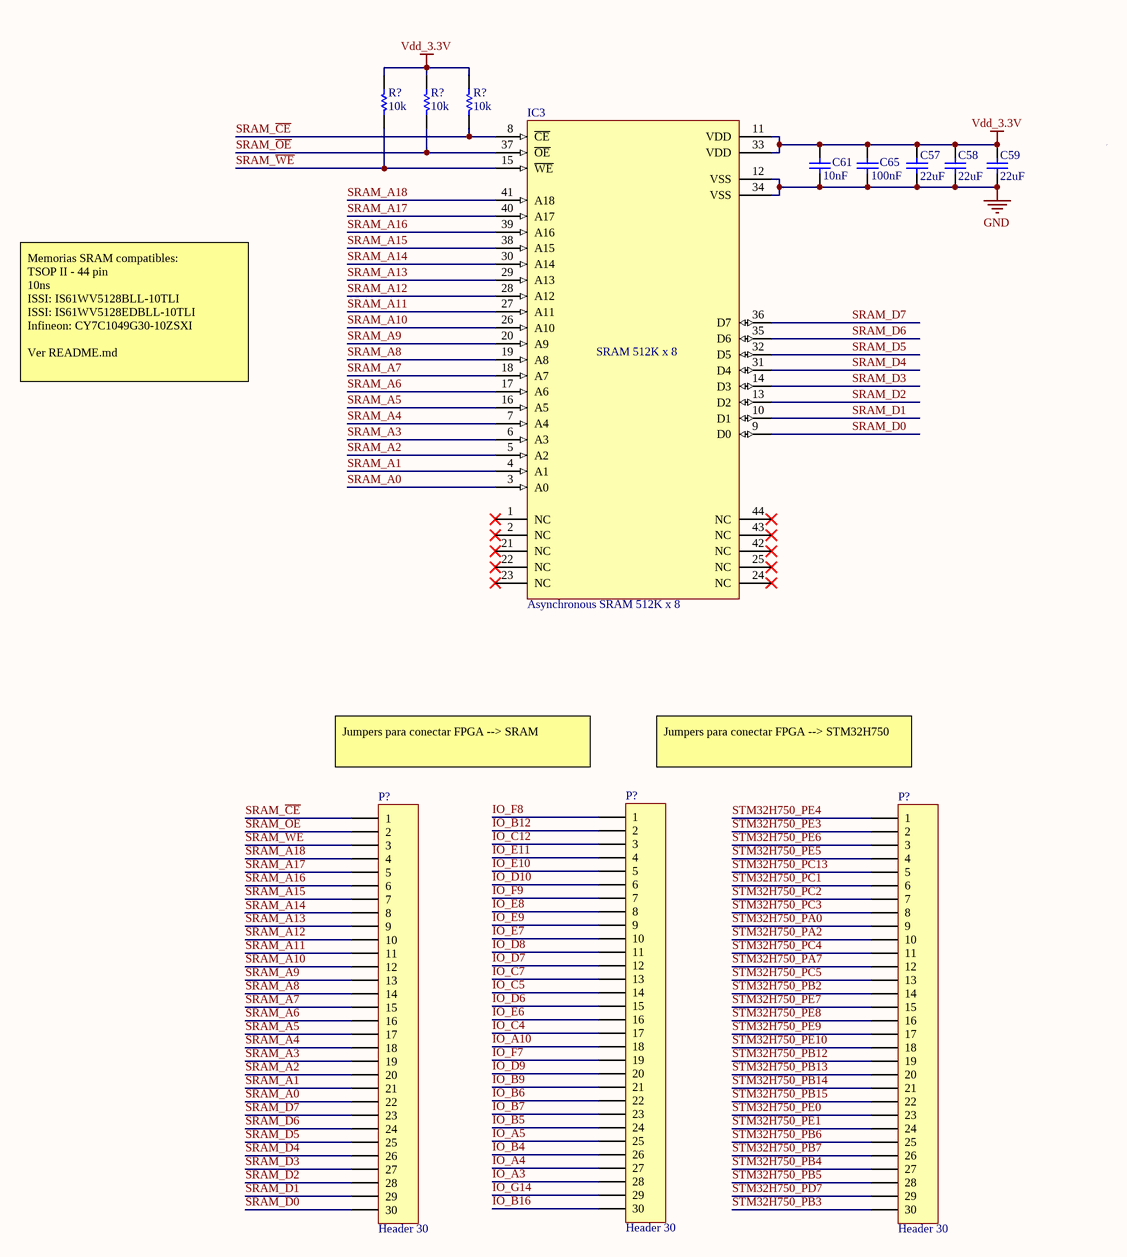
[diagram p6: SRAM.SchDoc]

### Parts
(Parts that share a designator on the sheet are numbered #1, #2 ... from top to bottom, then left to right.)
C57  value 22uF  [capacitor 0603]  (hidden comment: ceramic capacitor)
C58  value 22uF  [capacitor 0603]  (hidden comment: ceramic capacitor)
C59  value 22uF  [capacitor 0603]  (hidden comment: ceramic capacitor)
C61  value 10nF  [capacitor 0603]  (hidden comment: Ceramic capacitor)
C65  value 100nF  [capacitor 0603]  (hidden comment: Ceramic capacitor)
IC3  Asynchronous SRAM 512K x 8  [TSOP II - 44pin]
P?#6  Header 30  [HDR1X30]
P?#7  Header 30  [HDR1X30]
P?#8  Header 30  [HDR1X30]
R?#1  value 10k  [resistor 0603]  (hidden comment: resistor)
R?#2  value 10k  [resistor 0603]  (hidden comment: resistor)
R?#3  value 10k  [resistor 0603]  (hidden comment: resistor)

### Nets
GND: C57.1 C58.1 C59.1 C61.1 C65.1 IC3.12(VSS) IC3.34(VSS)
Vdd_3.3V: C57.2 C58.2 C59.2 C61.2 C65.2 IC3.11(VDD) IC3.33(VDD) R?#1.1 R?#2.1 R?#3.1
IO_A3: P?#7.28
IO_A4: P?#7.27
IO_A5: P?#7.25
IO_A10: P?#7.18
IO_B4: P?#7.26
IO_B5: P?#7.24
IO_B6: P?#7.22
IO_B7: P?#7.23
IO_B9: P?#7.21
IO_B12: P?#7.2
IO_B16: P?#7.30
IO_C4: P?#7.17
IO_C5: P?#7.14
IO_C7: P?#7.13
IO_C12: P?#7.3
IO_D6: P?#7.15
IO_D7: P?#7.12
IO_D8: P?#7.11
IO_D9: P?#7.20
IO_D10: P?#7.6
IO_E6: P?#7.16
IO_E7: P?#7.10
IO_E8: P?#7.8
IO_E9: P?#7.9
IO_E10: P?#7.5
IO_E11: P?#7.4
IO_F7: P?#7.19
IO_F8: P?#7.1
IO_F9: P?#7.7
IO_G14: P?#7.29
SRAM_A0: IC3.3(A0) P?#6.22
SRAM_A1: IC3.4(A1) P?#6.21
SRAM_A2: IC3.5(A2) P?#6.20
SRAM_A3: IC3.6(A3) P?#6.19
SRAM_A4: IC3.7(A4) P?#6.18
SRAM_A5: IC3.16(A5) P?#6.17
SRAM_A6: IC3.17(A6) P?#6.16
SRAM_A7: IC3.18(A7) P?#6.15
SRAM_A8: IC3.19(A8) P?#6.14
SRAM_A9: IC3.20(A9) P?#6.13
SRAM_A10: IC3.26(A10) P?#6.12
SRAM_A11: IC3.27(A11) P?#6.11
SRAM_A12: IC3.28(A12) P?#6.10
SRAM_A13: IC3.29(A13) P?#6.9
SRAM_A14: IC3.30(A14) P?#6.8
SRAM_A15: IC3.38(A15) P?#6.7
SRAM_A16: IC3.39(A16) P?#6.6
SRAM_A17: IC3.40(A17) P?#6.5
SRAM_A18: IC3.41(A18) P?#6.4
SRAM_~{CE}: IC3.8(~{CE}) P?#6.1 R?#3.2
SRAM_D0: IC3.9(D0) P?#6.30
SRAM_D1: IC3.10(D1) P?#6.29
SRAM_D2: IC3.13(D2) P?#6.28
SRAM_D3: IC3.14(D3) P?#6.27
SRAM_D4: IC3.31(D4) P?#6.26
SRAM_D5: IC3.32(D5) P?#6.25
SRAM_D6: IC3.35(D6) P?#6.24
SRAM_D7: IC3.36(D7) P?#6.23
SRAM_~{OE}: IC3.37(~{OE}) P?#6.2 R?#2.2
SRAM_~{WE}: IC3.15(~{WE}) P?#6.3 R?#1.2
STM32H750_PA0: P?#8.9
STM32H750_PA2: P?#8.10
STM32H750_PA7: P?#8.12
STM32H750_PB2: P?#8.14
STM32H750_PB3: P?#8.30
STM32H750_PB4: P?#8.27
STM32H750_PB5: P?#8.28
STM32H750_PB6: P?#8.25
STM32H750_PB7: P?#8.26
STM32H750_PB12: P?#8.19
STM32H750_PB13: P?#8.20
STM32H750_PB14: P?#8.21
STM32H750_PB15: P?#8.22
STM32H750_PC1: P?#8.6
STM32H750_PC2: P?#8.7
STM32H750_PC3: P?#8.8
STM32H750_PC4: P?#8.11
STM32H750_PC5: P?#8.13
STM32H750_PC13: P?#8.5
STM32H750_PD7: P?#8.29
STM32H750_PE0: P?#8.23
STM32H750_PE1: P?#8.24
STM32H750_PE3: P?#8.2
STM32H750_PE4: P?#8.1
STM32H750_PE5: P?#8.4
STM32H750_PE6: P?#8.3
STM32H750_PE7: P?#8.15
STM32H750_PE8: P?#8.16
STM32H750_PE9: P?#8.17
STM32H750_PE10: P?#8.18

Not connected (* = marked no-connect by the designer): IC3 1(NC)* 2(NC)* 21(NC)* 22(NC)* 23(NC)* 24(NC)* 25(NC)* 42(NC)* 43(NC)* 44(NC)*

### Notes on the sheet
- Memorias SRAM compatibles:
  TSOP II - 44 pin
  10ns
  ISSI: IS61WV5128BLL-10TLI
  ISSI: IS61WV5128EDBLL-10TLI
  Infineon: CY7C1049G30-10ZSXI
  Ver README.md
- (near P?#6) Jumpers para conectar FPGA --> SRAM
- (near P?#8) Jumpers para conectar FPGA --> STM32H750
- (in symbol Asynchronous SRAM 512K x 8) SRAM 512K x 8

### Library data of the parts
C57-C59 = ceramic capacitor: Multilayer ceramic capacitor; V: 6.3; LCSC part: C59461; Package: 0603
C61 C65 = Ceramic capacitor: Multilayer ceramic capacitor; V: 50; Package: 0603
  C61: LCSC part: C1591
  C65: LCSC part: C14663
IC3 = Asynchronous SRAM 512K x 8: MFR: ISSI; MFR part: IS61WV5128BLL-10TLI; Temp: −40 to +85 °C; Package: TSOP II - 44pin
P?#6-P?#8 = Header 30: Header, 30-Pin; LatestRevisionDate: 17-Jul-2002; LatestRevisionNote: Re-released for DXP Platform.; Publisher: Altium Limited
R?#1-R?#3 = resistor: Package: 0603

## Sheet Parallel_NOR_FLASH.SchDoc
size A3; SheetNumber: 8; SheetTotal: 15
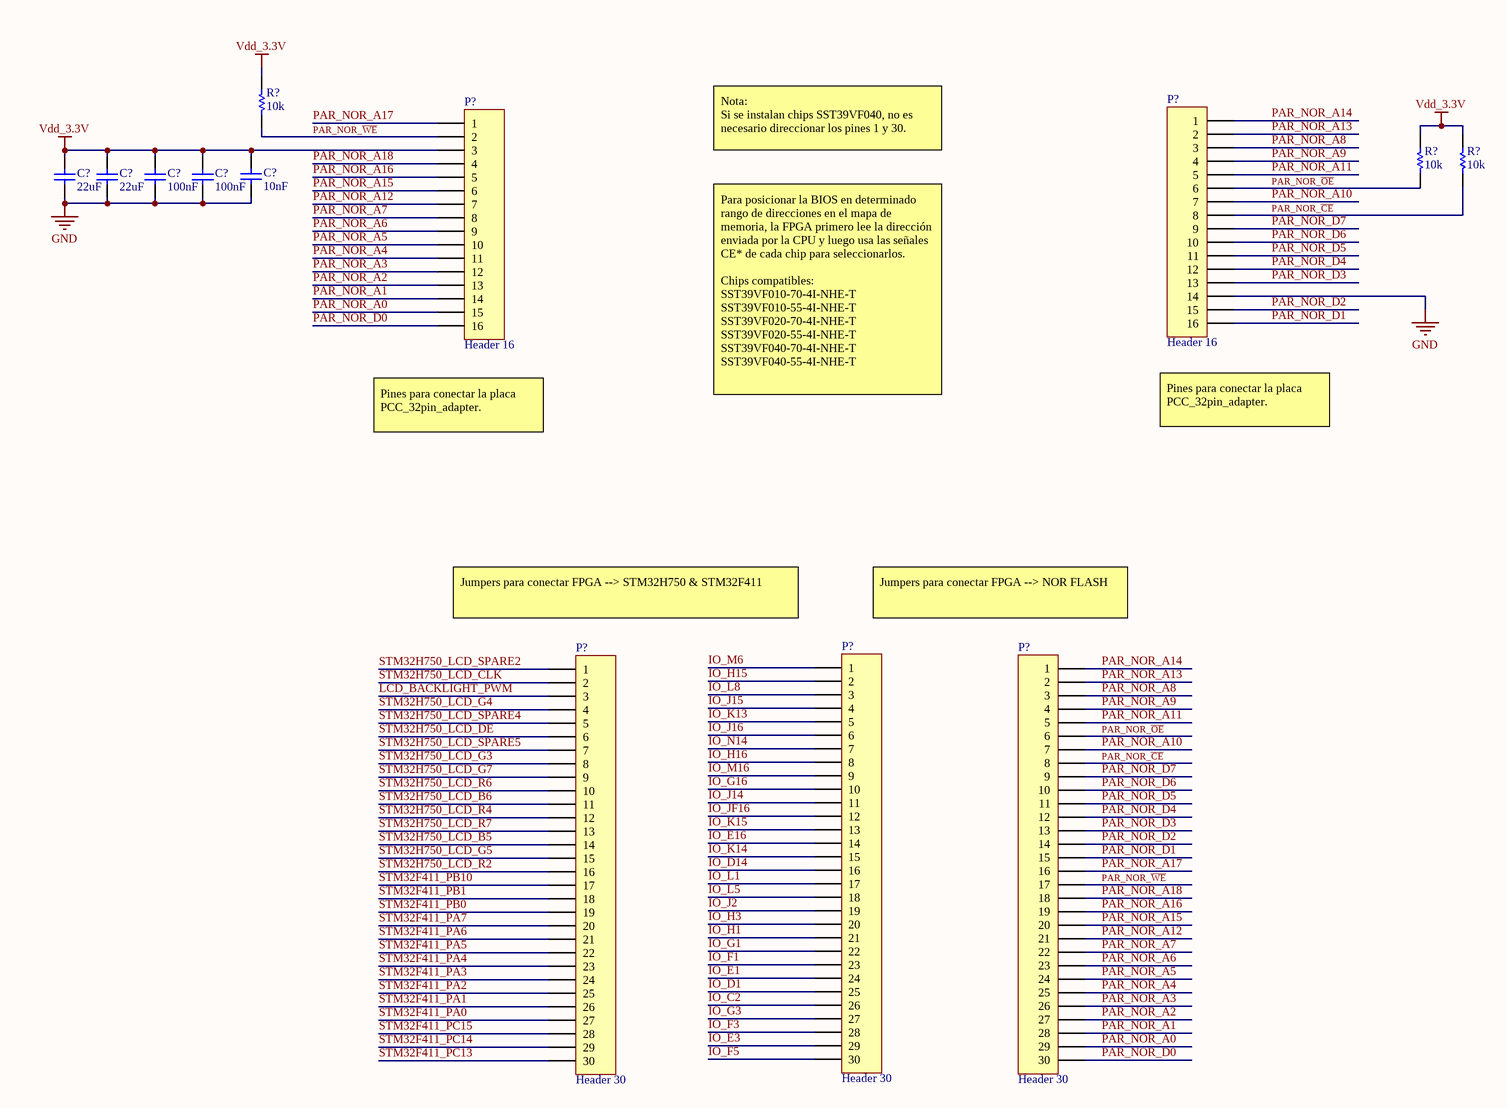
[diagram p7: Parallel_NOR_FLASH.SchDoc]

### Parts
(Parts that share a designator on the sheet are numbered #1, #2 ... from top to bottom, then left to right.)
C?#1  value 22uF  [capacitor 0603]  (hidden comment: ceramic capacitor)
C?#2  value 22uF  [capacitor 0603]  (hidden comment: ceramic capacitor)
C?#3  value 100nF  [capacitor 0603]  (hidden comment: Ceramic capacitor)
C?#4  value 100nF  [capacitor 0603]  (hidden comment: Ceramic capacitor)
C?#5  value 10nF  [capacitor 0603]  (hidden comment: Ceramic capacitor)
P?#9  Header 16  [HDR1X16]
P?#10  Header 16  [HDR1X16]
P?#11  Header 30  [HDR1X30]
P?#12  Header 30  [HDR1X30]
P?#13  Header 30  [HDR1X30]
R?#4  value 10k  [resistor 0603]  (hidden comment: resistor)
R?#5  value 10k  [resistor 0603]  (hidden comment: resistor)
R?#6  value 10k  [resistor 0603]  (hidden comment: resistor)

### Nets
GND: C?#1.1 C?#2.1 C?#3.1 C?#4.1 C?#5.1 P?#10.14
Vdd_3.3V: C?#1.2 C?#2.2 C?#3.2 C?#4.2 C?#5.2 P?#9.3 R?#4.1 R?#5.1 R?#6.1
IO_C2: P?#12.26
IO_D1: P?#12.25
IO_D14: P?#12.16
IO_E1: P?#12.24
IO_E3: P?#12.29
IO_E16: P?#12.14
IO_F1: P?#12.23
IO_F3: P?#12.28
IO_F5: P?#12.30
IO_G1: P?#12.22
IO_G3: P?#12.27
IO_G16: P?#12.10
IO_H1: P?#12.21
IO_H3: P?#12.20
IO_H15: P?#12.2
IO_H16: P?#12.8
IO_J2: P?#12.19
IO_J14: P?#12.11
IO_J15: P?#12.4
IO_J16: P?#12.6
IO_JF16: P?#12.12
IO_K13: P?#12.5
IO_K14: P?#12.15
IO_K15: P?#12.13
IO_L1: P?#12.17
IO_L5: P?#12.18
IO_L8: P?#12.3
IO_M6: P?#12.1
IO_M16: P?#12.9
IO_N14: P?#12.7
LCD_BACKLIGHT_PWM: P?#11.3
PAR_NOR_A0: P?#9.15 P?#13.29
PAR_NOR_A1: P?#9.14 P?#13.28
PAR_NOR_A2: P?#9.13 P?#13.27
PAR_NOR_A3: P?#9.12 P?#13.26
PAR_NOR_A4: P?#9.11 P?#13.25
PAR_NOR_A5: P?#9.10 P?#13.24
PAR_NOR_A6: P?#9.9 P?#13.23
PAR_NOR_A7: P?#9.8 P?#13.22
PAR_NOR_A8: P?#10.3 P?#13.3
PAR_NOR_A9: P?#10.4 P?#13.4
PAR_NOR_A10: P?#10.7 P?#13.7
PAR_NOR_A11: P?#10.5 P?#13.5
PAR_NOR_A12: P?#9.7 P?#13.21
PAR_NOR_A13: P?#10.2 P?#13.2
PAR_NOR_A14: P?#10.1 P?#13.1
PAR_NOR_A15: P?#9.6 P?#13.20
PAR_NOR_A16: P?#9.5 P?#13.19
PAR_NOR_A17: P?#9.1 P?#13.16
PAR_NOR_A18: P?#9.4 P?#13.18
PAR_NOR_~{CE}: P?#10.8 P?#13.8 R?#6.2
PAR_NOR_D0: P?#9.16 P?#13.30
PAR_NOR_D1: P?#10.16 P?#13.15
PAR_NOR_D2: P?#10.15 P?#13.14
PAR_NOR_D3: P?#10.13 P?#13.13
PAR_NOR_D4: P?#10.12 P?#13.12
PAR_NOR_D5: P?#10.11 P?#13.11
PAR_NOR_D6: P?#10.10 P?#13.10
PAR_NOR_D7: P?#10.9 P?#13.9
PAR_NOR_~{OE}: P?#10.6 P?#13.6 R?#5.2
PAR_NOR_~{WE}: P?#9.2 P?#13.17 R?#4.2
STM32F411_PA0: P?#11.27
STM32F411_PA1: P?#11.26
STM32F411_PA2: P?#11.25
STM32F411_PA3: P?#11.24
STM32F411_PA4: P?#11.23
STM32F411_PA5: P?#11.22
STM32F411_PA6: P?#11.21
STM32F411_PA7: P?#11.20
STM32F411_PB0: P?#11.19
STM32F411_PB1: P?#11.18
STM32F411_PB10: P?#11.17
STM32F411_PC13: P?#11.30
STM32F411_PC14: P?#11.29
STM32F411_PC15: P?#11.28
STM32H750_LCD_B5: P?#11.14
STM32H750_LCD_B6: P?#11.11
STM32H750_LCD_CLK: P?#11.2
STM32H750_LCD_DE: P?#11.6
STM32H750_LCD_G3: P?#11.8
STM32H750_LCD_G4: P?#11.4
STM32H750_LCD_G5: P?#11.15
STM32H750_LCD_G7: P?#11.9
STM32H750_LCD_R2: P?#11.16
STM32H750_LCD_R4: P?#11.12
STM32H750_LCD_R6: P?#11.10
STM32H750_LCD_R7: P?#11.13
STM32H750_LCD_SPARE2: P?#11.1
STM32H750_LCD_SPARE4: P?#11.5
STM32H750_LCD_SPARE5: P?#11.7

### Notes on the sheet
- Nota:
  Si se instalan chips SST39VF040, no es necesario direccionar los pines 1 y 30.
- (near P?#9) Pines para conectar la placa PCC_32pin_adapter.
- Para posicionar la BIOS en determinado rango de direcciones en el mapa de memoria, la FPGA primero lee la dirección enviada por la CPU y luego usa las señales CE* de cada chip para seleccionarlos.
  Chips compatibles:
  SST39VF010-70-4I-NHE-T
  SST39VF010-55-4I-NHE-T
  SST39VF020-70-4I-NHE-T
  SST39VF020-55-4I-NHE-T
  SST39VF040-70-4I-NHE-T
  SST39VF040-55-4I-NHE-T
- (near P?#10) Pines para conectar la placa PCC_32pin_adapter.
- (near P?#11) Jumpers para conectar FPGA --> STM32H750 & STM32F411
- (near P?#13) Jumpers para conectar FPGA --> NOR FLASH

### Library data of the parts
C?#1 C?#2 = ceramic capacitor: Multilayer ceramic capacitor; V: 6.3; LCSC part: C59461; Package: 0603
C?#3-C?#5 = Ceramic capacitor: Multilayer ceramic capacitor; V: 50; Package: 0603
  C?#3 C?#4: LCSC part: C14663
  C?#5: LCSC part: C1591
P?#9 P?#10 = Header 16: Header, 16-Pin; LatestRevisionDate: 17-Jul-2002; LatestRevisionNote: Re-released for DXP Platform.; Publisher: Altium Limited
P?#11-P?#13 = Header 30: Header, 30-Pin; LatestRevisionDate: 17-Jul-2002; LatestRevisionNote: Re-released for DXP Platform.; Publisher: Altium Limited
R?#4-R?#6 = resistor: Package: 0603

## Sheet NOR_flash.SchDoc
size A3; SheetNumber: 9; SheetTotal: 16
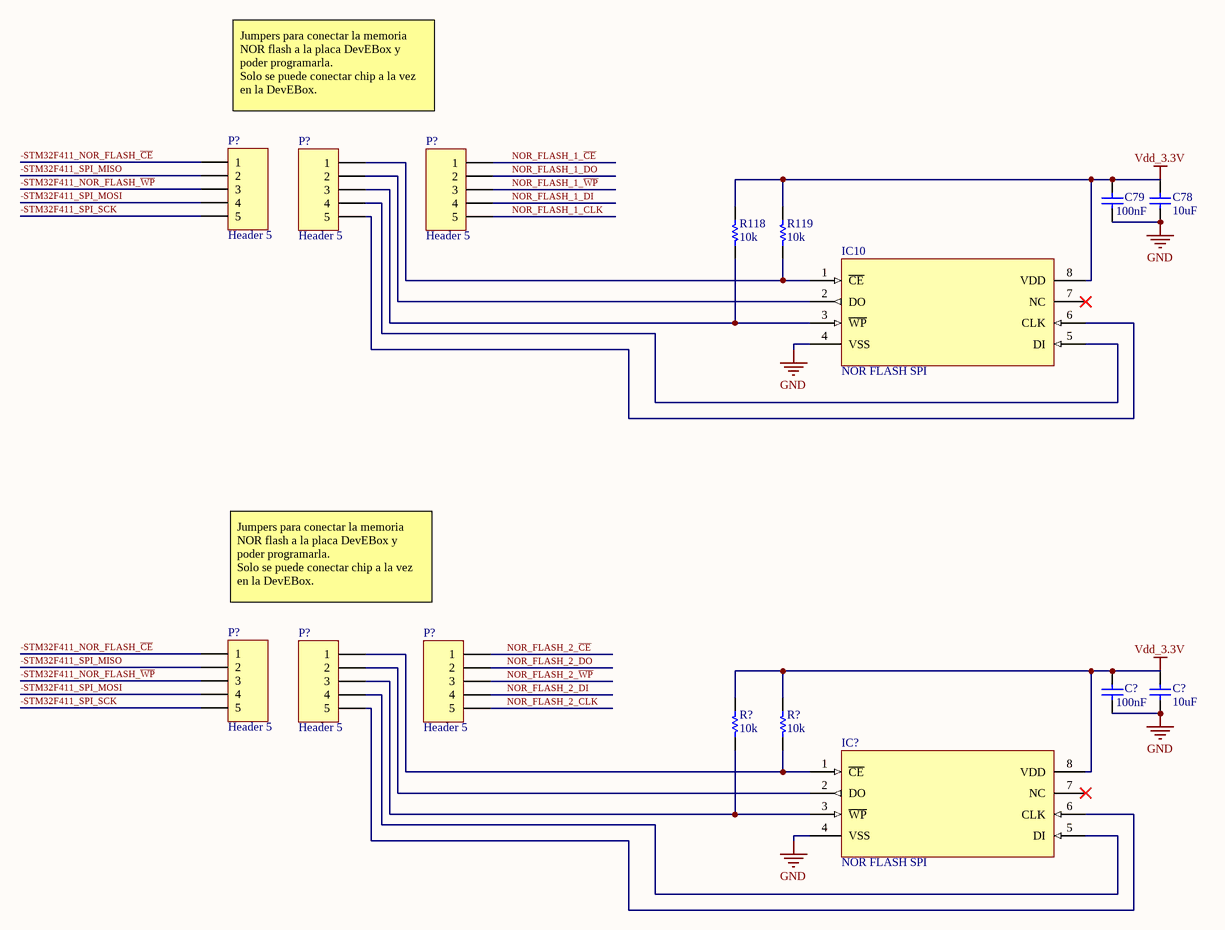
[diagram p8: NOR_flash.SchDoc]

### Parts
(Parts that share a designator on the sheet are numbered #1, #2 ... from top to bottom, then left to right.)
C78  value 10uF  [capacitor 0603]  (hidden comment: ceramic capacitor)
C79  value 100nF  [capacitor 0603]  (hidden comment: Ceramic capacitor)
C?#6  value 100nF  [capacitor 0603]  (hidden comment: Ceramic capacitor)
C?#7  value 10uF  [capacitor 0603]  (hidden comment: ceramic capacitor)
IC10  NOR FLASH SPI  [SOP8 / SOIC8 without dissipation]
IC?  NOR FLASH SPI  [SOP8 / SOIC8 without dissipation]
P?#14  Header 5  [HDR1X5]
P?#15  Header 5  [HDR1X5]
P?#16  Header 5  [HDR1X5]
P?#17  Header 5  [HDR1X5]
P?#18  Header 5  [HDR1X5]
P?#19  Header 5  [HDR1X5]
R118  value 10k  [resistor 0603]  (hidden comment: resistor)
R119  value 10k  [resistor 0603]  (hidden comment: resistor)
R?#7  value 10k  [resistor 0603]  (hidden comment: resistor)
R?#8  value 10k  [resistor 0603]  (hidden comment: resistor)

### Nets
GND: C78.1 C79.1 C?#6.1 C?#7.1 IC10.4(VSS) IC?.4(VSS)
Vdd_3.3V: C78.2 C79.2 C?#6.2 C?#7.2 IC10.8(VDD) IC?.8(VDD) R118.1 R119.1 R?#7.1 R?#8.1
-STM32F411_NOR_FLASH_~{CE}: P?#14.1 P?#17.1
-STM32F411_NOR_FLASH_~{WP}: P?#14.3 P?#17.3
-STM32F411_SPI_MISO: P?#14.2 P?#17.2
-STM32F411_SPI_MOSI: P?#14.4 P?#17.4
-STM32F411_SPI_SCK: P?#14.5 P?#17.5
NOR_FLASH_1_~{CE}: P?#16.1
NOR_FLASH_1_CLK: P?#16.5
NOR_FLASH_1_DI: P?#16.4
NOR_FLASH_1_DO: P?#16.2
NOR_FLASH_1_~{WP}: P?#16.3
NOR_FLASH_2_~{CE}: P?#19.1
NOR_FLASH_2_CLK: P?#19.5
NOR_FLASH_2_DI: P?#19.4
NOR_FLASH_2_DO: P?#19.2
NOR_FLASH_2_~{WP}: P?#19.3
NetIC10_1: IC10.1(~{CE}) P?#15.1 R119.2
NetIC10_2: IC10.2(DO) P?#15.2
NetIC10_3: IC10.3(~{WP}) P?#15.3 R118.2
NetIC10_5: IC10.5(DI) P?#15.4
NetIC10_6: IC10.6(CLK) P?#15.5
NetIC?_1: IC?.1(~{CE}) P?#18.1 R?#8.2
NetIC?_2: IC?.2(DO) P?#18.2
NetIC?_3: IC?.3(~{WP}) P?#18.3 R?#7.2
NetIC?_5: IC?.5(DI) P?#18.4
NetIC?_6: IC?.6(CLK) P?#18.5

Not connected (* = marked no-connect by the designer): IC10 7(NC)*; IC? 7(NC)*

### Notes on the sheet
- (near P?#14) Jumpers para conectar la memoria NOR flash a la placa DevEBox y poder programarla.
  Solo se puede conectar chip a la vez en la DevEBox.
- (near P?#17) Jumpers para conectar la memoria NOR flash a la placa DevEBox y poder programarla.
  Solo se puede conectar chip a la vez en la DevEBox.

### Library data of the parts
C78 C?#7 = ceramic capacitor: Multilayer ceramic capacitor; V: 6.3; LCSC part: C1691; Package: 0603
C79 C?#6 = Ceramic capacitor: Multilayer ceramic capacitor; V: 50; LCSC part: C14663; Package: 0603
IC10 IC? = NOR FLASH SPI: NOR flash memory / SPI
P?#14-P?#19 = Header 5: Header, 5-Pin; LatestRevisionDate: 17-Jul-2002; LatestRevisionNote: Re-released for DXP Platform.; Publisher: Altium Limited
R118 R119 R?#7 R?#8 = resistor: Package: 0603

## Sheet USB_TTL_converter.SchDoc
size A3; SheetNumber: 10; SheetTotal: 15
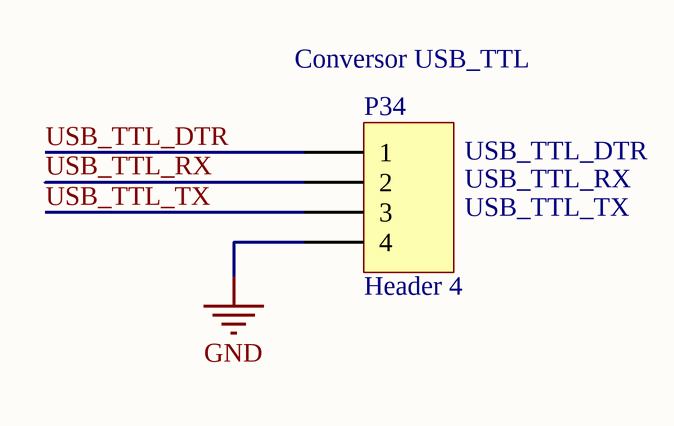
[diagram p9: USB_TTL_converter.SchDoc]

### Parts
P34  Header 4  [HDR1X4]

### Nets
GND: P34.4
USB_TTL_DTR: P34.1
USB_TTL_RX: P34.2
USB_TTL_TX: P34.3

### Notes on the sheet
- (near P34) Conversor USB_TTL
- (near P34) USB_TTL_DTR
- (near P34) USB_TTL_RX
- (near P34) USB_TTL_TX

### Library data of the parts
P34 = Header 4: Header, 4-Pin; LatestRevisionDate: 17-Jul-2002; LatestRevisionNote: Re-released for DXP Platform.; Publisher: Altium Limited

## Sheet buzzer.SchDoc
size A3; SheetNumber: 11; SheetTotal: 16; SPICEModelCacheMSYVYFRR: <root> / <DocumentId>MSYVYFRR</DocumentId> / <CacheFrame Number="0"> / <Model Name="nmos" Kind="MDL"> / <Text>*Default N-Channel MOSFET / *Pinout: D,G,S / .MODEL NMOS NMOS()</Text> / </Model> / </CacheFrame> / </root>
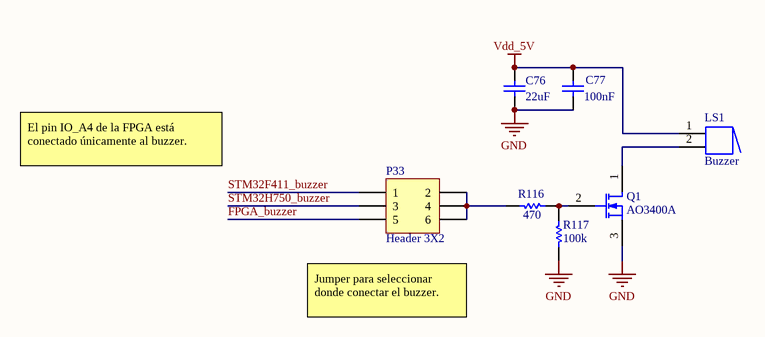
[diagram p10: buzzer.SchDoc]

### Parts
C76  value 22uF  [capacitor 0603]  (hidden comment: ceramic capacitor)
C77  value 100nF  [capacitor 0805]  (hidden comment: ceramic capacitor)
LS1  Buzzer  [Buzzer 12mm x 8.25mm - 6.5mm pitch]
P33  Header 3X2  [HDR2X3]
Q1  AO3400A  [sot-23]
R116  value 470  [resistor 0603]  (hidden comment: resistor)
R117  value 100k  [resistor 0603]  (hidden comment: resistor)

### Nets
GND: C76.1 C77.2 Q1.3(S) R117.2
Vdd_5V: C76.2 C77.1 LS1.1
FPGA_buzzer: P33.5
STM32F411_buzzer: P33.1
STM32H750_buzzer: P33.3
NetLS1_2: LS1.2 Q1.1(D)
NetP33_2: P33.2 P33.4 P33.6 R116.1
NetQ1_2: Q1.2(G) R116.2 R117.1

### Notes on the sheet
- El pin IO_A4 de la FPGA está conectado únicamente al buzzer.
- (near P33) Jumper para seleccionar donde conectar el buzzer.

### Library data of the parts
C76 = ceramic capacitor: Multilayer ceramic capacitor; V: 6.3; LCSC part: C59461; Package: 0603
C77 = ceramic capacitor: Multilayer ceramic capacitor; V: 50; LCSC part: C1711; Package: 0805
LS1 = Buzzer: Magnetic Transducer Buzzer; pin to pad: 1A>none 2A>none; Published: 24-Mar-1999; LatestRevisionDate: 17-Dec-2003; LatestRevisionNote: Schematic revised, PCB Footprint replaced.; DatasheetVersion: 17-Dec-2003; PackageReference: ABSM-1574; Publisher: Altium Limited; PackageDescription: Magnetic Transducer Buzzer; ComponentLink1Description: Manufacturer Link; ComponentLink1URL: http://www.megastar.com/linecard/buzzmode/index.php
P33 = Header 3X2: Header, 3-Pin, Dual row; LatestRevisionDate: 17-Jul-2002; LatestRevisionNote: Re-released for DXP Platform.; Publisher: Altium Limited
Q1 = MOSFET-N: N-Channel MOSFET; pin to pad: 1>3 2>1 3>2; MFR: Alpha & Omega Semicon; Package: SOT-23-3L; LCSC part: C20917; MFR part: AO3400A
R116 R117 = resistor: Package: 0603

## Sheet micro_sd.SchDoc
size A3; SheetNumber: 12; SheetTotal: 15
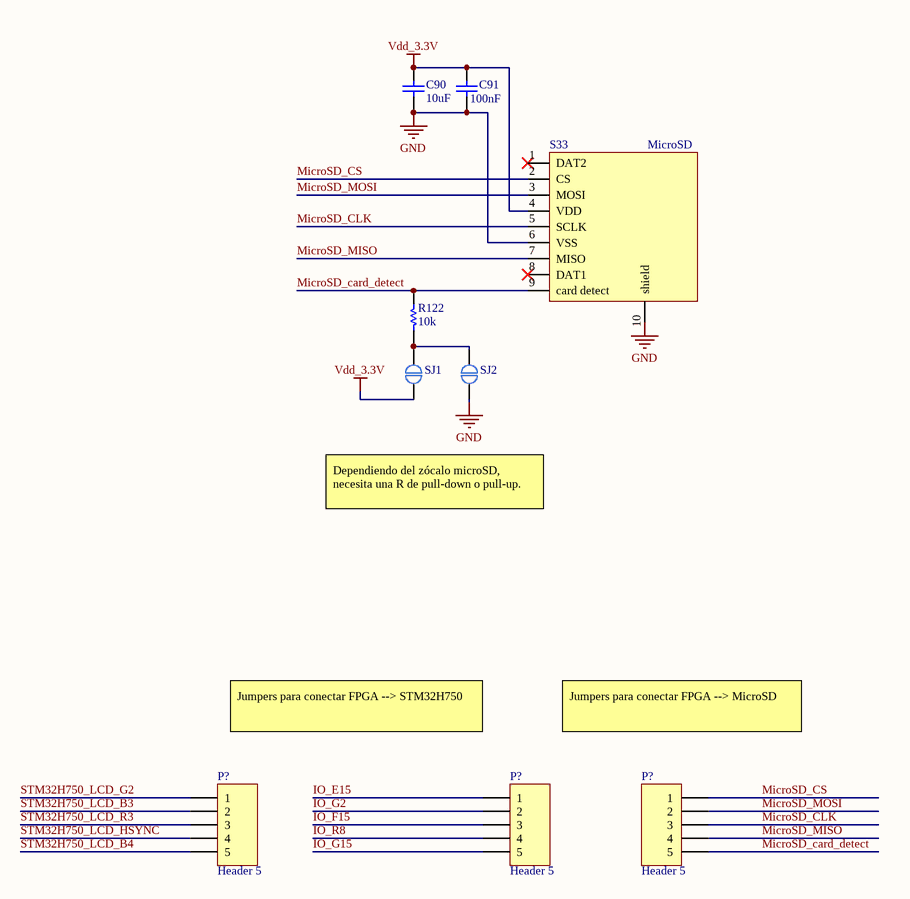
[diagram p11: micro_sd.SchDoc]

### Parts
(Parts that share a designator on the sheet are numbered #1, #2 ... from top to bottom, then left to right.)
C90  value 10uF  [capacitor 0603]  (hidden comment: ceramic capacitor)
C91  value 100nF  [capacitor 0603]  (hidden comment: Ceramic capacitor)
P?#20  Header 5  [HDR1X5]
P?#21  Header 5  [HDR1X5]
P?#22  Header 5  [HDR1X5]
R122  value 10k  [resistor 0603]  (hidden comment: resistor)
S33  MicroSD  [Micro sd]
SJ1  Solder jumper NO  [normally open solder jumper]  (value not drawn)
SJ2  Solder jumper NO  [normally open solder jumper]  (value not drawn)

### Nets
GND: C90.1 C91.1 S33.6(VSS) S33.10(shield) SJ2.1
Vdd_3.3V: C90.2 C91.2 S33.4(VDD) SJ1.1
IO_E15: P?#21.1
IO_F15: P?#21.3
IO_G2: P?#21.2
IO_G15: P?#21.5
IO_R8: P?#21.4
MicroSD_card_detect: P?#22.5 R122.1 S33.9(card_detect)
MicroSD_CLK: P?#22.3 S33.5(SCLK)
MicroSD_CS: P?#22.1 S33.2(CS)
MicroSD_MISO: P?#22.4 S33.7(MISO)
MicroSD_MOSI: P?#22.2 S33.3(MOSI)
STM32H750_LCD_B3: P?#20.2
STM32H750_LCD_B4: P?#20.5
STM32H750_LCD_G2: P?#20.1
STM32H750_LCD_HSYNC: P?#20.4
STM32H750_LCD_R3: P?#20.3
NetR122_2: R122.2 SJ1.2 SJ2.2

Not connected (* = marked no-connect by the designer): S33 1(DAT2)* 8(DAT1)*

### Notes on the sheet
- Dependiendo del zócalo microSD, necesita una R de pull-down o pull-up.
- Jumpers para conectar FPGA --> STM32H750
- Jumpers para conectar FPGA --> MicroSD

### Library data of the parts
C90 = ceramic capacitor: Multilayer ceramic capacitor; V: 6.3; LCSC part: C1691; Package: 0603
C91 = Ceramic capacitor: Multilayer ceramic capacitor; V: 50; LCSC part: C14663; Package: 0603
P?#20-P?#22 = Header 5: Header, 5-Pin; LatestRevisionDate: 17-Jul-2002; LatestRevisionNote: Re-released for DXP Platform.; Publisher: Altium Limited
S33 = Micro SD: Micro SD memory
SJ1 SJ2 = Solder jumper NO: Normally open solder jumper
R122 = resistor: Package: 0603

## Sheet LEDs.SchDoc
size A3; SheetNumber: 7; SheetTotal: 15
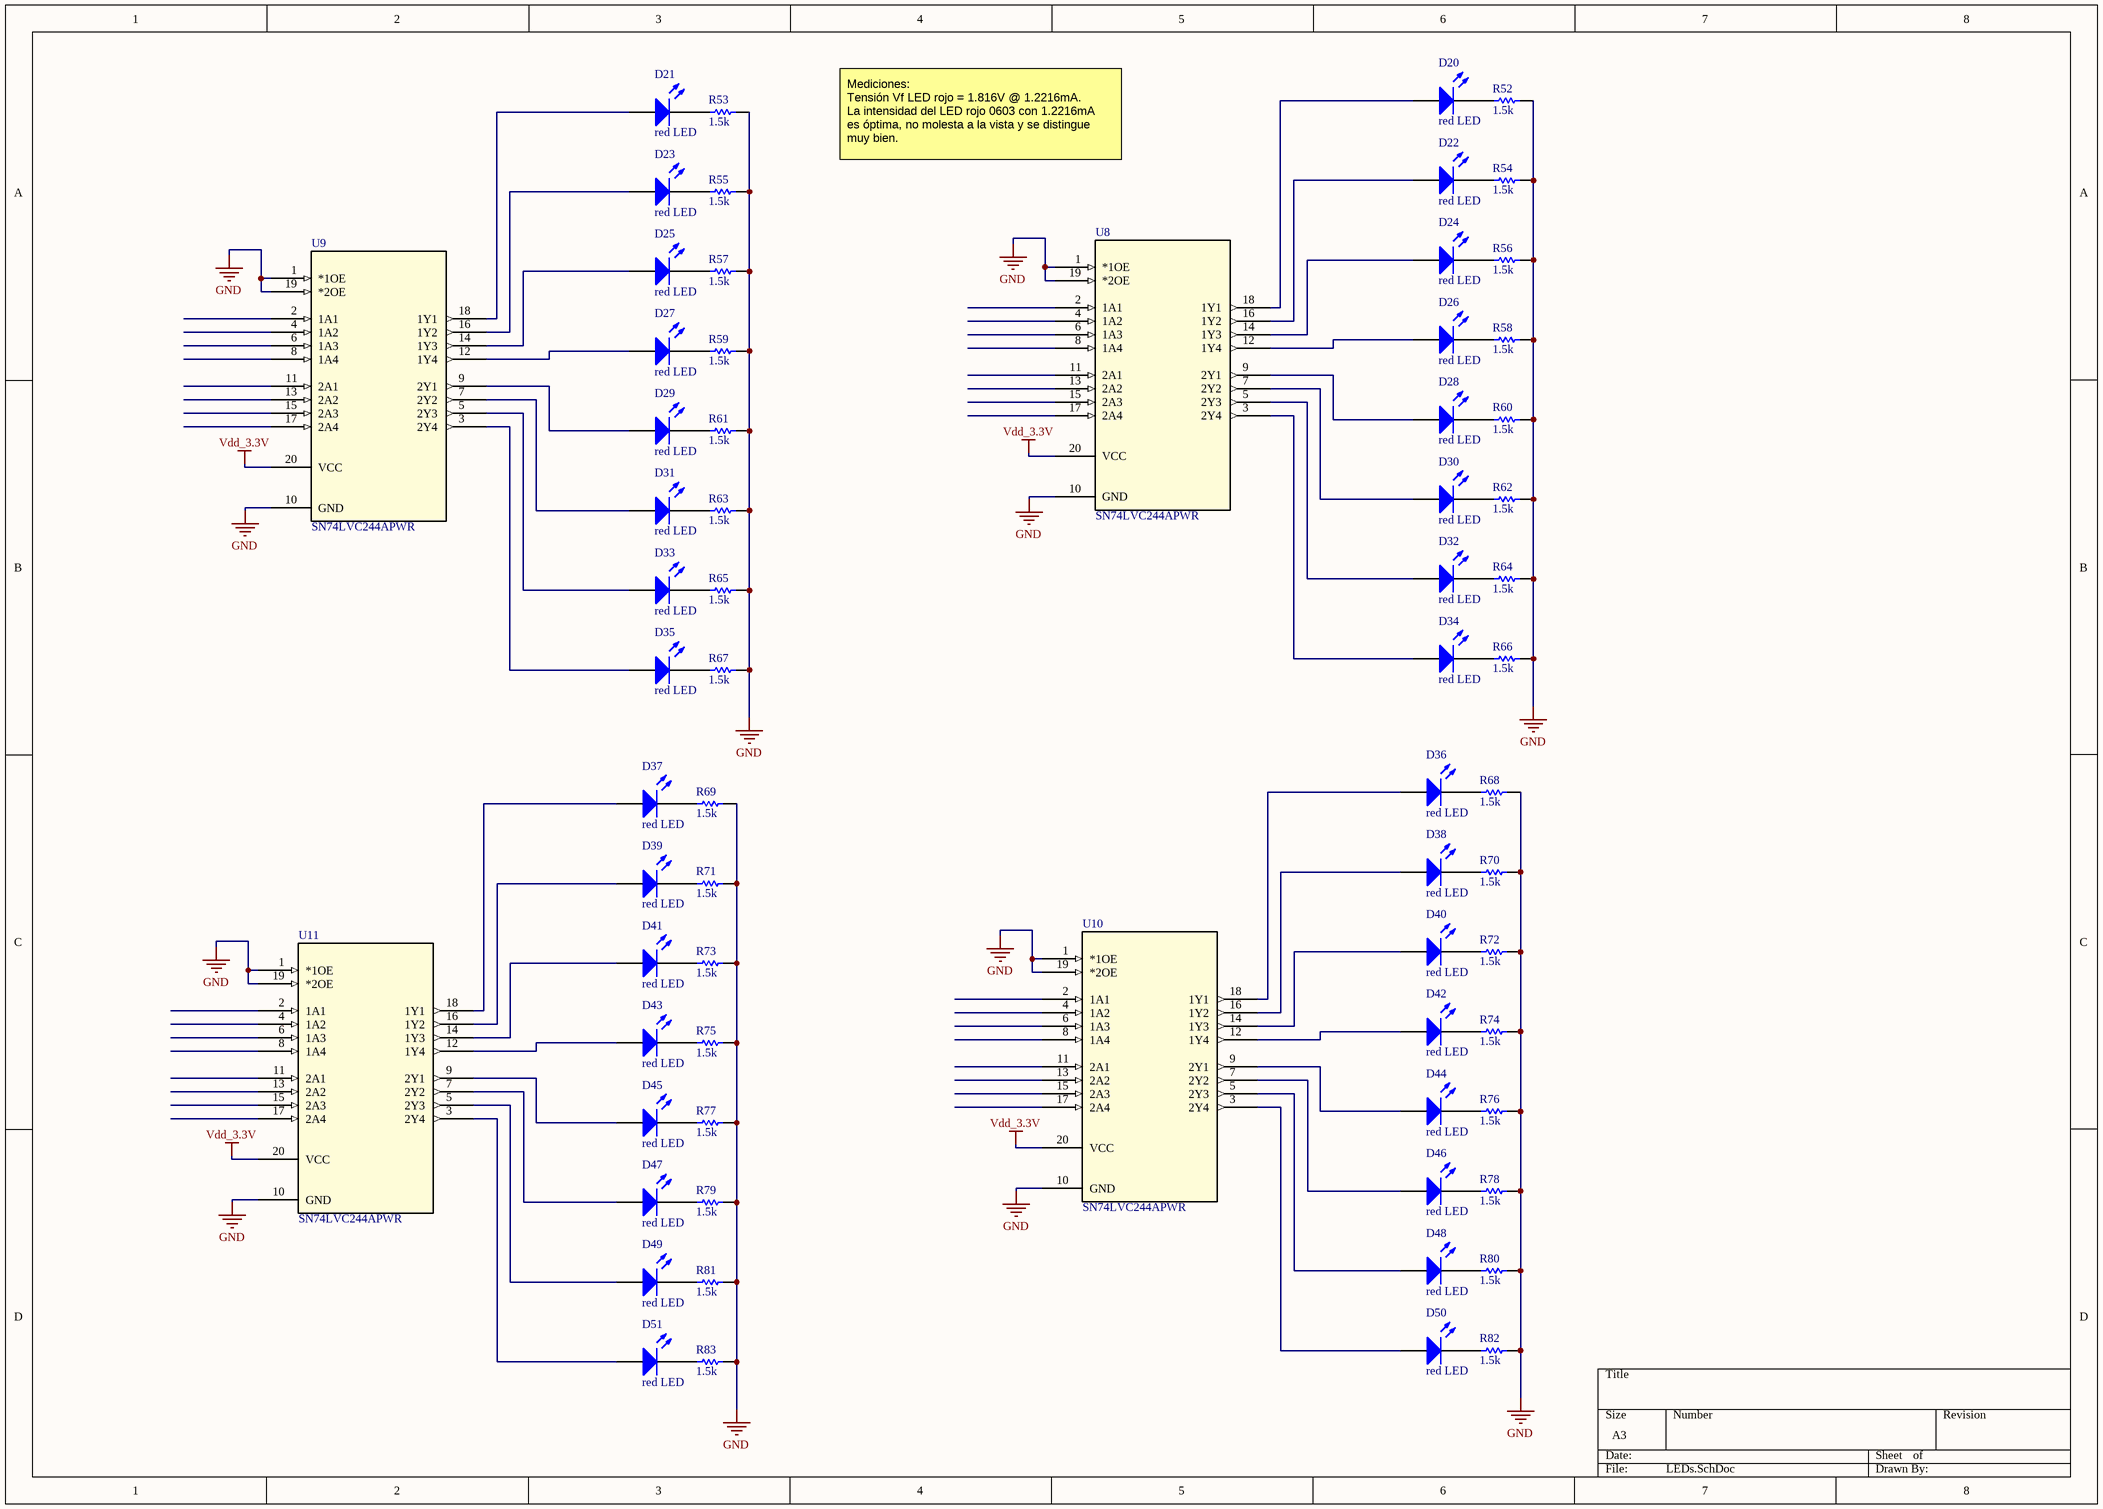
[diagram p12: LEDs.SchDoc]

### Parts
D20  red LED  [led 0603 clear]
D21  red LED  [led 0603 clear]
D22  red LED  [led 0603 clear]
D23  red LED  [led 0603 clear]
D24  red LED  [led 0603 clear]
D25  red LED  [led 0603 clear]
D26  red LED  [led 0603 clear]
D27  red LED  [led 0603 clear]
D28  red LED  [led 0603 clear]
D29  red LED  [led 0603 clear]
D30  red LED  [led 0603 clear]
D31  red LED  [led 0603 clear]
D32  red LED  [led 0603 clear]
D33  red LED  [led 0603 clear]
D34  red LED  [led 0603 clear]
D35  red LED  [led 0603 clear]
D36  red LED  [led 0603 clear]
D37  red LED  [led 0603 clear]
D38  red LED  [led 0603 clear]
D39  red LED  [led 0603 clear]
D40  red LED  [led 0603 clear]
D41  red LED  [led 0603 clear]
D42  red LED  [led 0603 clear]
D43  red LED  [led 0603 clear]
D44  red LED  [led 0603 clear]
D45  red LED  [led 0603 clear]
D46  red LED  [led 0603 clear]
D47  red LED  [led 0603 clear]
D48  red LED  [led 0603 clear]
D49  red LED  [led 0603 clear]
D50  red LED  [led 0603 clear]
D51  red LED  [led 0603 clear]
R52  value 1.5k  [resistor 0603]  (hidden comment: resistor)
R53  value 1.5k  [resistor 0603]  (hidden comment: resistor)
R54  value 1.5k  [resistor 0603]  (hidden comment: resistor)
R55  value 1.5k  [resistor 0603]  (hidden comment: resistor)
R56  value 1.5k  [resistor 0603]  (hidden comment: resistor)
R57  value 1.5k  [resistor 0603]  (hidden comment: resistor)
R58  value 1.5k  [resistor 0603]  (hidden comment: resistor)
R59  value 1.5k  [resistor 0603]  (hidden comment: resistor)
R60  value 1.5k  [resistor 0603]  (hidden comment: resistor)
R61  value 1.5k  [resistor 0603]  (hidden comment: resistor)
R62  value 1.5k  [resistor 0603]  (hidden comment: resistor)
R63  value 1.5k  [resistor 0603]  (hidden comment: resistor)
R64  value 1.5k  [resistor 0603]  (hidden comment: resistor)
R65  value 1.5k  [resistor 0603]  (hidden comment: resistor)
R66  value 1.5k  [resistor 0603]  (hidden comment: resistor)
R67  value 1.5k  [resistor 0603]  (hidden comment: resistor)
R68  value 1.5k  [resistor 0603]  (hidden comment: resistor)
R69  value 1.5k  [resistor 0603]  (hidden comment: resistor)
R70  value 1.5k  [resistor 0603]  (hidden comment: resistor)
R71  value 1.5k  [resistor 0603]  (hidden comment: resistor)
R72  value 1.5k  [resistor 0603]  (hidden comment: resistor)
R73  value 1.5k  [resistor 0603]  (hidden comment: resistor)
R74  value 1.5k  [resistor 0603]  (hidden comment: resistor)
R75  value 1.5k  [resistor 0603]  (hidden comment: resistor)
R76  value 1.5k  [resistor 0603]  (hidden comment: resistor)
R77  value 1.5k  [resistor 0603]  (hidden comment: resistor)
R78  value 1.5k  [resistor 0603]  (hidden comment: resistor)
R79  value 1.5k  [resistor 0603]  (hidden comment: resistor)
R80  value 1.5k  [resistor 0603]  (hidden comment: resistor)
R81  value 1.5k  [resistor 0603]  (hidden comment: resistor)
R82  value 1.5k  [resistor 0603]  (hidden comment: resistor)
R83  value 1.5k  [resistor 0603]  (hidden comment: resistor)
U8  SN74LVC244APWR  [PW20]
U9  SN74LVC244APWR  [PW20]
U10  SN74LVC244APWR  [PW20]
U11  SN74LVC244APWR  [PW20]

### Nets
GND: R52.1 R53.1 R54.1 R55.1 R56.1 R57.1 R58.1 R59.1 R60.1 R61.1 R62.1 R63.1 R64.1 R65.1 R66.1 R67.1 R68.1 R69.1 R70.1 R71.1 R72.1 R73.1 R74.1 R75.1 R76.1 R77.1 R78.1 R79.1 R80.1 R81.1 R82.1 R83.1 U8.1(*1OE) U8.10(GND) U8.19(*2OE) U9.1(*1OE) U9.10(GND) U9.19(*2OE) U10.1(*1OE) U10.10(GND) U10.19(*2OE) U11.1(*1OE) U11.10(GND) U11.19(*2OE)
Vdd_3.3V: U8.20(VCC) U9.20(VCC) U10.20(VCC) U11.20(VCC)
NetD20_1: D20.1(A) U8.18(1Y1)
NetD20_2: D20.2(K) R52.2
NetD21_1: D21.1(A) U9.18(1Y1)
NetD21_2: D21.2(K) R53.2
NetD22_1: D22.1(A) U8.16(1Y2)
NetD22_2: D22.2(K) R54.2
NetD23_1: D23.1(A) U9.16(1Y2)
NetD23_2: D23.2(K) R55.2
NetD24_1: D24.1(A) U8.14(1Y3)
NetD24_2: D24.2(K) R56.2
NetD25_1: D25.1(A) U9.14(1Y3)
NetD25_2: D25.2(K) R57.2
NetD26_1: D26.1(A) U8.12(1Y4)
NetD26_2: D26.2(K) R58.2
NetD27_1: D27.1(A) U9.12(1Y4)
NetD27_2: D27.2(K) R59.2
NetD28_1: D28.1(A) U8.9(2Y1)
NetD28_2: D28.2(K) R60.2
NetD29_1: D29.1(A) U9.9(2Y1)
NetD29_2: D29.2(K) R61.2
NetD30_1: D30.1(A) U8.7(2Y2)
NetD30_2: D30.2(K) R62.2
NetD31_1: D31.1(A) U9.7(2Y2)
NetD31_2: D31.2(K) R63.2
NetD32_1: D32.1(A) U8.5(2Y3)
NetD32_2: D32.2(K) R64.2
NetD33_1: D33.1(A) U9.5(2Y3)
NetD33_2: D33.2(K) R65.2
NetD34_1: D34.1(A) U8.3(2Y4)
NetD34_2: D34.2(K) R66.2
NetD35_1: D35.1(A) U9.3(2Y4)
NetD35_2: D35.2(K) R67.2
NetD36_1: D36.1(A) U10.18(1Y1)
NetD36_2: D36.2(K) R68.2
NetD37_1: D37.1(A) U11.18(1Y1)
NetD37_2: D37.2(K) R69.2
NetD38_1: D38.1(A) U10.16(1Y2)
NetD38_2: D38.2(K) R70.2
NetD39_1: D39.1(A) U11.16(1Y2)
NetD39_2: D39.2(K) R71.2
NetD40_1: D40.1(A) U10.14(1Y3)
NetD40_2: D40.2(K) R72.2
NetD41_1: D41.1(A) U11.14(1Y3)
NetD41_2: D41.2(K) R73.2
NetD42_1: D42.1(A) U10.12(1Y4)
NetD42_2: D42.2(K) R74.2
NetD43_1: D43.1(A) U11.12(1Y4)
NetD43_2: D43.2(K) R75.2
NetD44_1: D44.1(A) U10.9(2Y1)
NetD44_2: D44.2(K) R76.2
NetD45_1: D45.1(A) U11.9(2Y1)
NetD45_2: D45.2(K) R77.2
NetD46_1: D46.1(A) U10.7(2Y2)
NetD46_2: D46.2(K) R78.2
NetD47_1: D47.1(A) U11.7(2Y2)
NetD47_2: D47.2(K) R79.2
NetD48_1: D48.1(A) U10.5(2Y3)
NetD48_2: D48.2(K) R80.2
NetD49_1: D49.1(A) U11.5(2Y3)
NetD49_2: D49.2(K) R81.2
NetD50_1: D50.1(A) U10.3(2Y4)
NetD50_2: D50.2(K) R82.2
NetD51_1: D51.1(A) U11.3(2Y4)
NetD51_2: D51.2(K) R83.2

Not connected (* = marked no-connect by the designer): U8 2(1A1) 4(1A2) 6(1A3) 8(1A4) 11(2A1) 13(2A2) 15(2A3) 17(2A4); U9 2(1A1) 4(1A2) 6(1A3) 8(1A4) 11(2A1) 13(2A2) 15(2A3) 17(2A4); U10 2(1A1) 4(1A2) 6(1A3) 8(1A4) 11(2A1) 13(2A2) 15(2A3) 17(2A4); U11 2(1A1) 4(1A2) 6(1A3) 8(1A4) 11(2A1) 13(2A2) 15(2A3) 17(2A4)

### Notes on the sheet
- Mediciones:
  Tensión Vf LED rojo = 1.816V @ 1.2216mA.
  La intensidad del LED rojo 0603 con 1.2216mA
  es óptima, no molesta a la vista y se distingue
  muy bien.

### Library data of the parts
D20-D51 = LED2: Red LED 0603; Package: 0603 - 3.2X1.6X1.1; LCSC part: C2286
U8-U11 = SN74LVC244APWR: 8-ch, 1.65-V to 3.6-V buffers with 3-state outputs 20-TSSOP -40 to 125; Manufacturer_Name: Texas Instruments; Copyright: Copyright (C) 2026 Ultra Librarian. All rights reserved.; Manufacturer_Part_Number: SN74LVC244APWR; Datasheet: https://www.ti.com/lit/gpn/sn74lvc244a; RefDes: RefDes; Type: Type
R52-R83 = resistor: LCSC part: C22843; Package: 0603

## Sheet buttons_switches.SchDoc
size A3; SheetNumber: 8; SheetTotal: 15
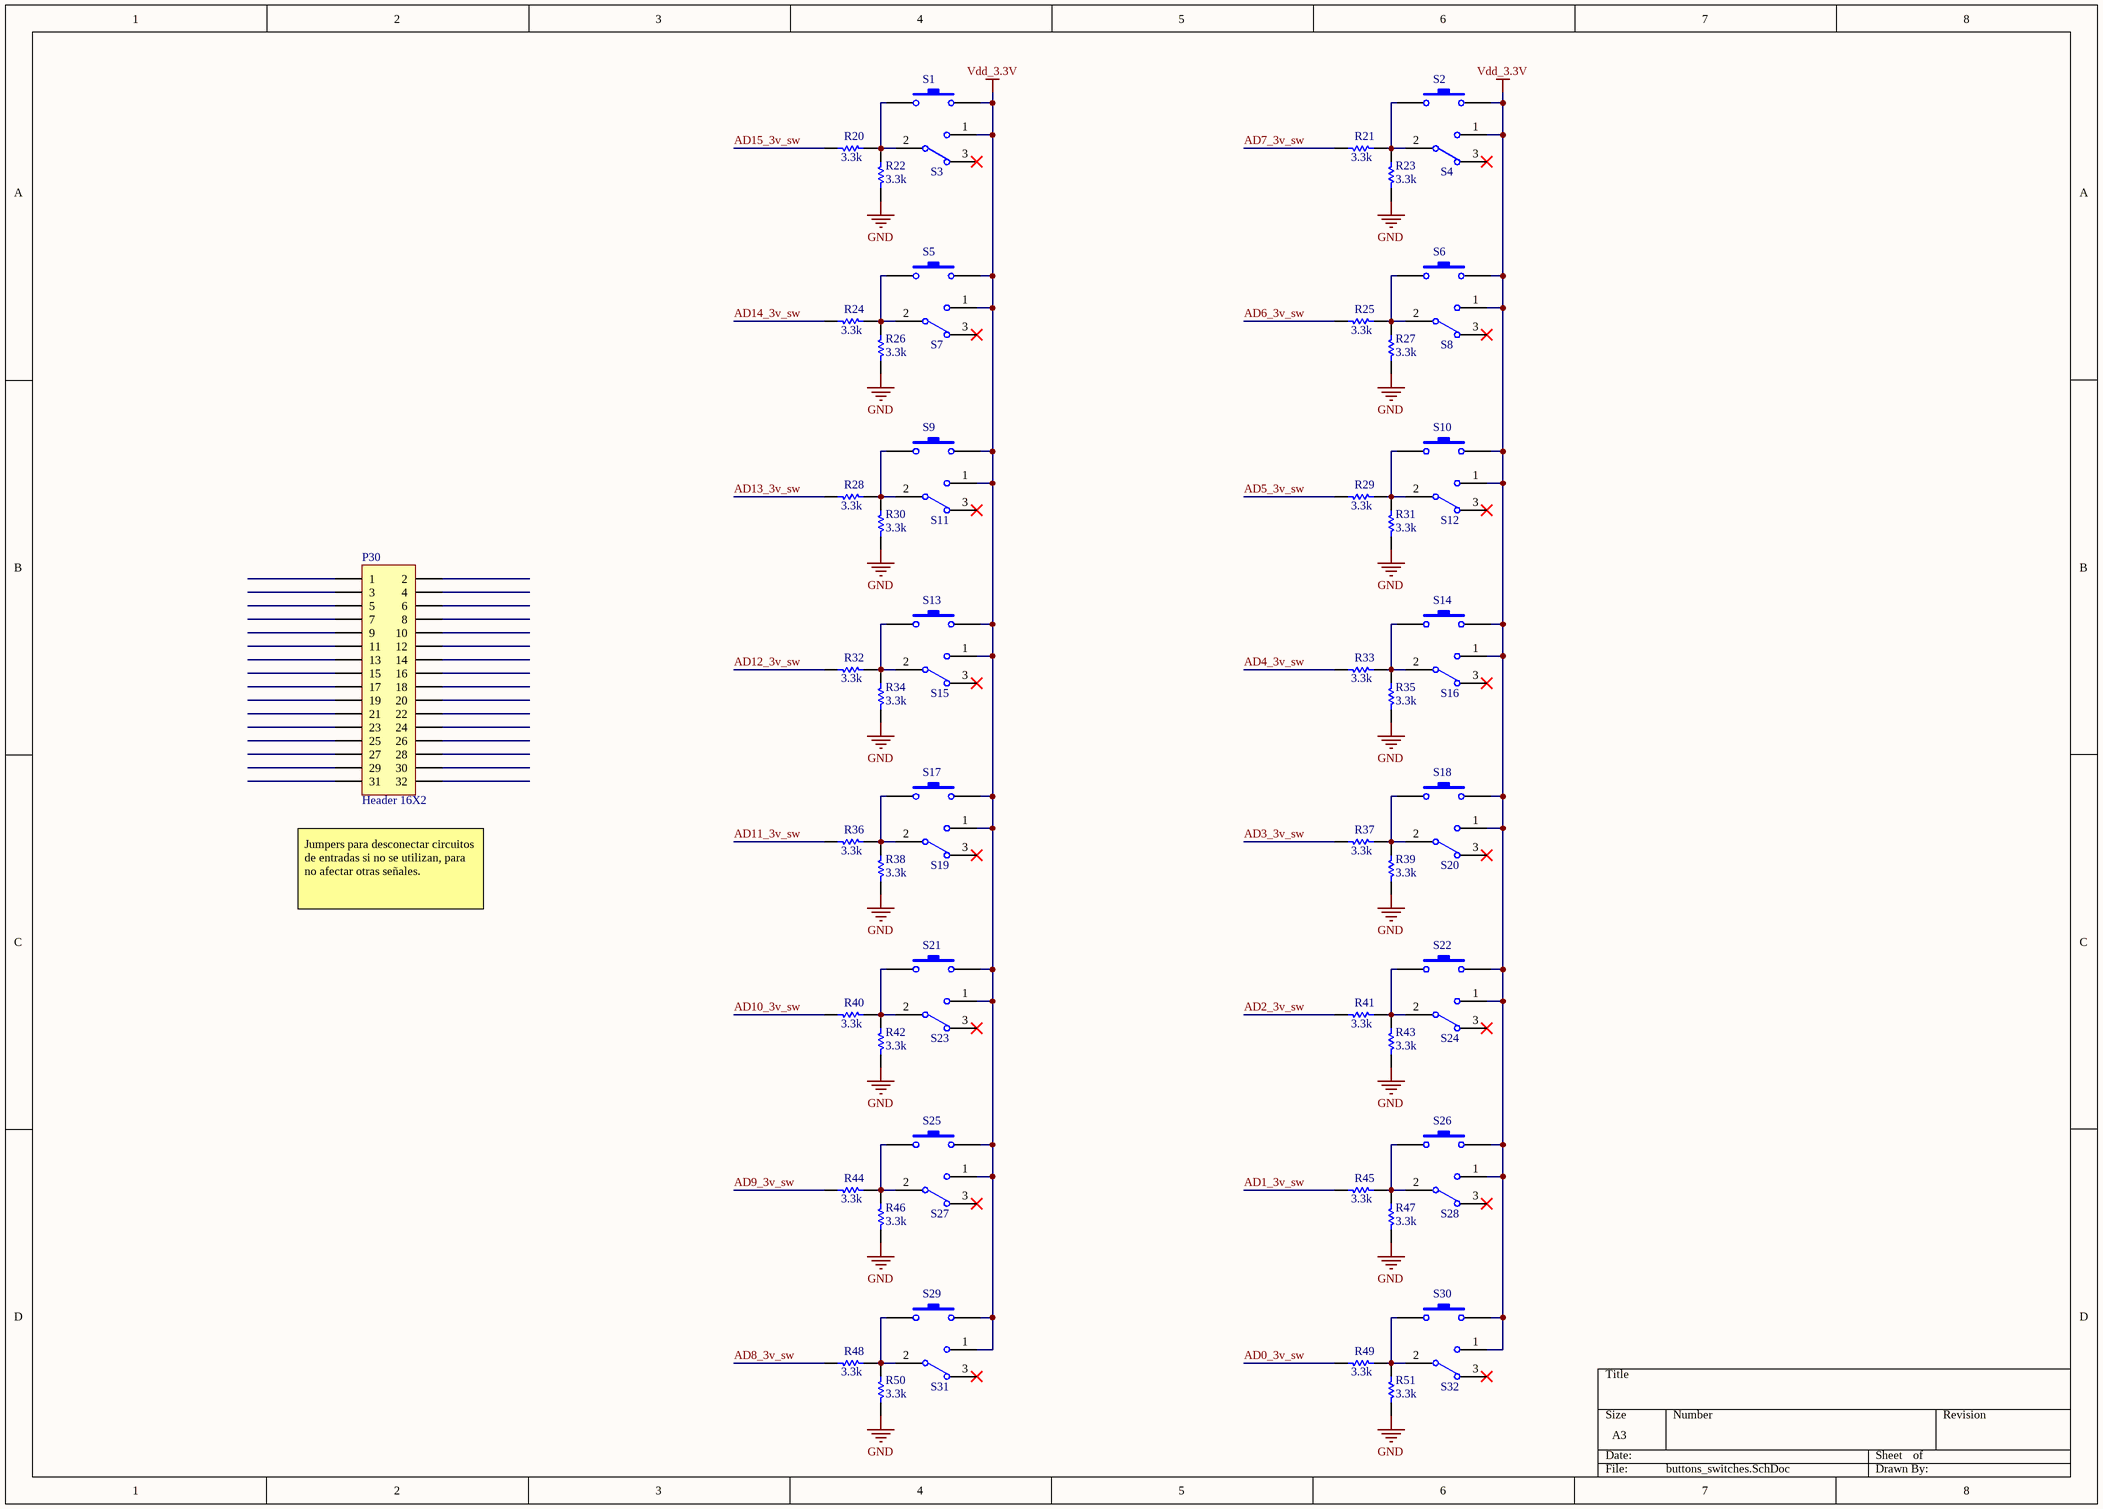
[diagram p13: buttons_switches.SchDoc]

### Parts
P30  Header 16X2  [HDR2X16]
R20  value 3.3k  [resistor 0603]  (hidden comment: resistor)
R21  value 3.3k  [resistor 0603]  (hidden comment: resistor)
R22  value 3.3k  [resistor 0603]  (hidden comment: resistor)
R23  value 3.3k  [resistor 0603]  (hidden comment: resistor)
R24  value 3.3k  [resistor 0603]  (hidden comment: resistor)
R25  value 3.3k  [resistor 0603]  (hidden comment: resistor)
R26  value 3.3k  [resistor 0603]  (hidden comment: resistor)
R27  value 3.3k  [resistor 0603]  (hidden comment: resistor)
R28  value 3.3k  [resistor 0603]  (hidden comment: resistor)
R29  value 3.3k  [resistor 0603]  (hidden comment: resistor)
R30  value 3.3k  [resistor 0603]  (hidden comment: resistor)
R31  value 3.3k  [resistor 0603]  (hidden comment: resistor)
R32  value 3.3k  [resistor 0603]  (hidden comment: resistor)
R33  value 3.3k  [resistor 0603]  (hidden comment: resistor)
R34  value 3.3k  [resistor 0603]  (hidden comment: resistor)
R35  value 3.3k  [resistor 0603]  (hidden comment: resistor)
R36  value 3.3k  [resistor 0603]  (hidden comment: resistor)
R37  value 3.3k  [resistor 0603]  (hidden comment: resistor)
R38  value 3.3k  [resistor 0603]  (hidden comment: resistor)
R39  value 3.3k  [resistor 0603]  (hidden comment: resistor)
R40  value 3.3k  [resistor 0603]  (hidden comment: resistor)
R41  value 3.3k  [resistor 0603]  (hidden comment: resistor)
R42  value 3.3k  [resistor 0603]  (hidden comment: resistor)
R43  value 3.3k  [resistor 0603]  (hidden comment: resistor)
R44  value 3.3k  [resistor 0603]  (hidden comment: resistor)
R45  value 3.3k  [resistor 0603]  (hidden comment: resistor)
R46  value 3.3k  [resistor 0603]  (hidden comment: resistor)
R47  value 3.3k  [resistor 0603]  (hidden comment: resistor)
R48  value 3.3k  [resistor 0603]  (hidden comment: resistor)
R49  value 3.3k  [resistor 0603]  (hidden comment: resistor)
R50  value 3.3k  [resistor 0603]  (hidden comment: resistor)
R51  value 3.3k  [resistor 0603]  (hidden comment: resistor)
S1  Button  [Tact switch]  (value not drawn)
S2  Button  [Tact switch]  (value not drawn)
S3  SW-SPDT  [Slide switch 2mm pitch]  (value not drawn)
S4  SW-SPDT  [Slide switch 2mm pitch]  (value not drawn)
S5  Button  [Tact switch]  (value not drawn)
S6  Button  [Tact switch]  (value not drawn)
S7  SW-SPDT  [Slide switch 2mm pitch]  (value not drawn)
S8  SW-SPDT  [Slide switch 2mm pitch]  (value not drawn)
S9  Button  [Tact switch]  (value not drawn)
S10  Button  [Tact switch]  (value not drawn)
S11  SW-SPDT  [Slide switch 2mm pitch]  (value not drawn)
S12  SW-SPDT  [Slide switch 2mm pitch]  (value not drawn)
S13  Button  [Tact switch]  (value not drawn)
S14  Button  [Tact switch]  (value not drawn)
S15  SW-SPDT  [Slide switch 2mm pitch]  (value not drawn)
S16  SW-SPDT  [Slide switch 2mm pitch]  (value not drawn)
S17  Button  [Tact switch]  (value not drawn)
S18  Button  [Tact switch]  (value not drawn)
S19  SW-SPDT  [Slide switch 2mm pitch]  (value not drawn)
S20  SW-SPDT  [Slide switch 2mm pitch]  (value not drawn)
S21  Button  [Tact switch]  (value not drawn)
S22  Button  [Tact switch]  (value not drawn)
S23  SW-SPDT  [Slide switch 2mm pitch]  (value not drawn)
S24  SW-SPDT  [Slide switch 2mm pitch]  (value not drawn)
S25  Button  [Tact switch]  (value not drawn)
S26  Button  [Tact switch]  (value not drawn)
S27  SW-SPDT  [Slide switch 2mm pitch]  (value not drawn)
S28  SW-SPDT  [Slide switch 2mm pitch]  (value not drawn)
S29  Button  [Tact switch]  (value not drawn)
S30  Button  [Tact switch]  (value not drawn)
S31  SW-SPDT  [Slide switch 2mm pitch]  (value not drawn)
S32  SW-SPDT  [Slide switch 2mm pitch]  (value not drawn)

### Nets
GND: R22.2 R23.2 R26.2 R27.2 R30.2 R31.2 R34.2 R35.2 R38.2 R39.2 R42.2 R43.2 R46.2 R47.2 R50.2 R51.2
Vdd_3.3V: S1.2 S2.2 S3.1 S4.1 S5.2 S6.2 S7.1 S8.1 S9.2 S10.2 S11.1 S12.1 S13.2 S14.2 S15.1 S16.1 S17.2 S18.2 S19.1 S20.1 S21.2 S22.2 S23.1 S24.1 S25.2 S26.2 S27.1 S28.1 S29.2 S30.2 S31.1 S32.1
AD0_3v_sw: R49.1
AD1_3v_sw: R45.1
AD2_3v_sw: R41.1
AD3_3v_sw: R37.1
AD4_3v_sw: R33.1
AD5_3v_sw: R29.1
AD6_3v_sw: R25.1
AD7_3v_sw: R21.1
AD8_3v_sw: R48.1
AD9_3v_sw: R44.1
AD10_3v_sw: R40.1
AD11_3v_sw: R36.1
AD12_3v_sw: R32.1
AD13_3v_sw: R28.1
AD14_3v_sw: R24.1
AD15_3v_sw: R20.1
NetR20_2: R20.2 R22.1 S1.1 S3.2
NetR21_2: R21.2 R23.1 S2.1 S4.2
NetR24_2: R24.2 R26.1 S5.1 S7.2
NetR25_2: R25.2 R27.1 S6.1 S8.2
NetR28_2: R28.2 R30.1 S9.1 S11.2
NetR29_2: R29.2 R31.1 S10.1 S12.2
NetR32_2: R32.2 R34.1 S13.1 S15.2
NetR33_2: R33.2 R35.1 S14.1 S16.2
NetR36_2: R36.2 R38.1 S17.1 S19.2
NetR37_2: R37.2 R39.1 S18.1 S20.2
NetR40_2: R40.2 R42.1 S21.1 S23.2
NetR41_2: R41.2 R43.1 S22.1 S24.2
NetR44_2: R44.2 R46.1 S25.1 S27.2
NetR45_2: R45.2 R47.1 S26.1 S28.2
NetR48_2: R48.2 R50.1 S29.1 S31.2
NetR49_2: R49.2 R51.1 S30.1 S32.2

Not connected (* = marked no-connect by the designer): P30 1 2 3 4 5 6 7 8 9 10 11 12 13 14 15 16 17 18 19 20 21 22 23 24 25 26 27 28 29 30 31 32; S3 3*; S4 3*; S7 3*; S8 3*; S11 3*; S12 3*; S15 3*; S16 3*; S19 3*; S20 3*; S23 3*; S24 3*; S27 3*; S28 3*; S31 3*; S32 3*

### Notes on the sheet
- (near P30) Jumpers para desconectar circuitos de entradas si no se utilizan, para no afectar otras señales.

### Library data of the parts
P30 = Header 16X2: Header, 16-Pin, Dual row; LatestRevisionDate: 17-Jul-2002; LatestRevisionNote: Re-released for DXP Platform.; Publisher: Altium Limited
S1 S2 S5 S6 S9 S10 S13 S14 S17 S18 S21 S22 S25 S26 S29 S30 = SW-PB: Switch; pin to pad: 2>3
S3 S4 S7 S8 S11 S12 S15 S16 S19 S20 S23 S24 S27 S28 S31 S32 = SW-SPDT: SPDT Subminiature Toggle Switch, Right Angle Mounting, Vertical Actuation; Published: 24-Mar-1999; LatestRevisionDate: 17-Dec-2003; LatestRevisionNote: Schematic revised, PCB Footprint replaced.; DatasheetVersion: 05-Dec-2000; PackageReference: TL36WW15050; Publisher: Altium Limited; PackageDescription: Switch; 4 Leads; ComponentLink1Description: Manufacturer Link; ComponentLink1URL: http://www.apem.com
R20-R51 = resistor: Package: 0603